# Altium project ESD_Mainboard.PrjPcb (part 1 of 2)
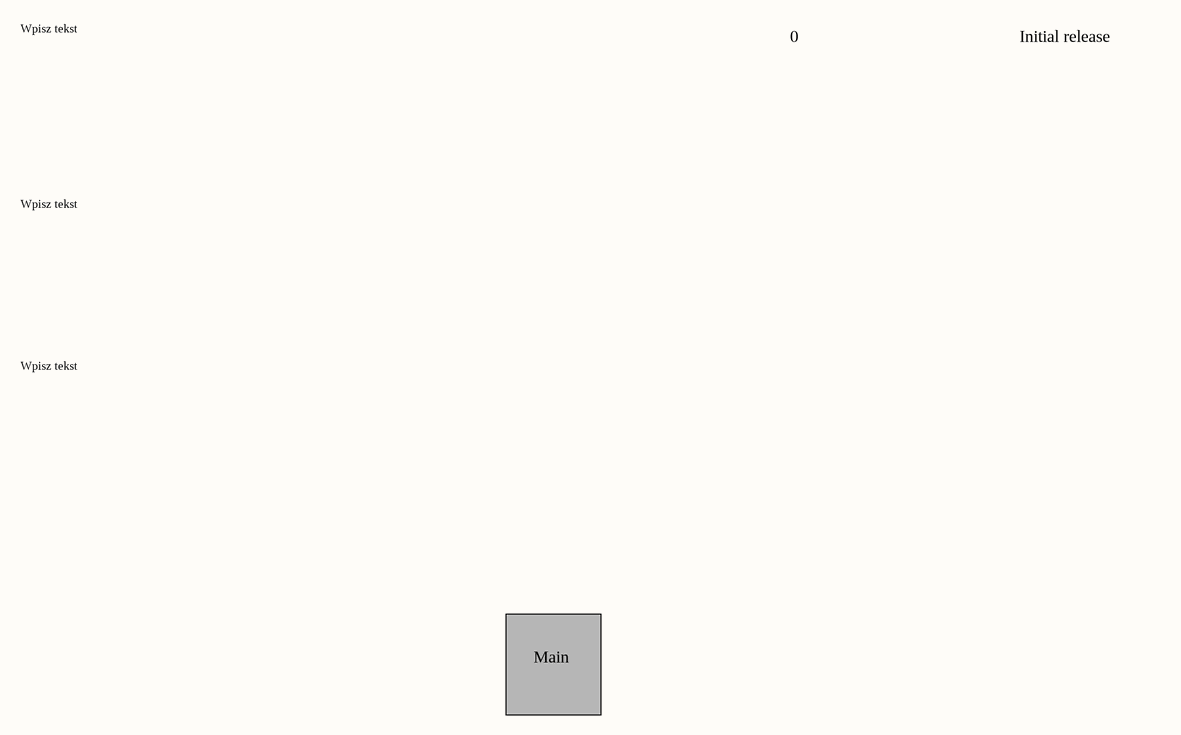
[diagram p0: ESD_Mainboard_Overview.SchDoc]
Title: Wpisz tekst; SpecificRequirements: Wpisz tekst; ShortDescriptionOfFunctionalities: Wpisz tekst; Revision: Wpisz tekst; ProjectID: Wpisz tekst; PCB_Number: Wpisz tekst; Overview: Wpisz tekst; ModuleID: Wpisz tekst; Engineer: Wpisz tekst; Date: Wpisz tekst; ApprovedBy: Wpisz tekst
9 sheets, 269 parts. Net scope: flat (ports and power ports of the same name join across sheets).
Board file: ESD_Mainboard_PCB.PcbDoc
Sheets:
  ESD_Mainboard_Overview.SchDoc
    U_Main = Main.SchDoc
      U_RFID = RFID.SchDoc
      U_ETHERNET = ETHERNET.SchDoc
      U_POWER_SUPPLY = POWER_SUPPLY.SchDoc
      U_IOs = IOs.SchDoc
      U_ANALOG_MEASUREMENT_CIRCUIT = ANALOG_MEASUREMENT_CIRCUIT.SchDoc
        U_ANALOG_BUFFER = ANALOG_BUFFER.SchDoc
        U_ANALOG_BUFFER = ANALOG_BUFFER.SchDoc
      U_MCU = MCU.SchDoc

## Sheet ESD_Mainboard_Overview.SchDoc: Wpisz tekst
size A4; SheetNumber: 1; SheetTotal: 2

### Sub-sheets
U_Main = Main.SchDoc: no entries

### Notes on the sheet
- 0
- Initial release
- Main
- Project description
- Revision table
- Overview
- REV
- Release date
- Description
- Specific requirements
- Short description of functionalities
- Variant description
- Schematic
- Design Engineer
- No.
- Info
- This document and the information it
- contains, including the principles of
- design are the proprietary confidential
- property of MC Electronics.
- Maciej Czerwiński Electronics
- NIP: PL1251711124
- Konopnickiej 16A
- 05-250 Radzymin
- biuro@mcelectronics.biz
- Approval Engineer
- This information is submitted to you
- with the agreement that it is not to be
- disclosed to third parties without prior
- written consent from MC Electronics.
- Acceptance of this document constitutes
- Title:
- greement to these restrictions.
- Date:
- Project ID
- Sheet:
- of
- Module ID -
- Revision
- -
- Size A4

## Sheet Main.SchDoc: Wpisz tekst
size A3; SheetNumber: 2; SheetTotal: 9
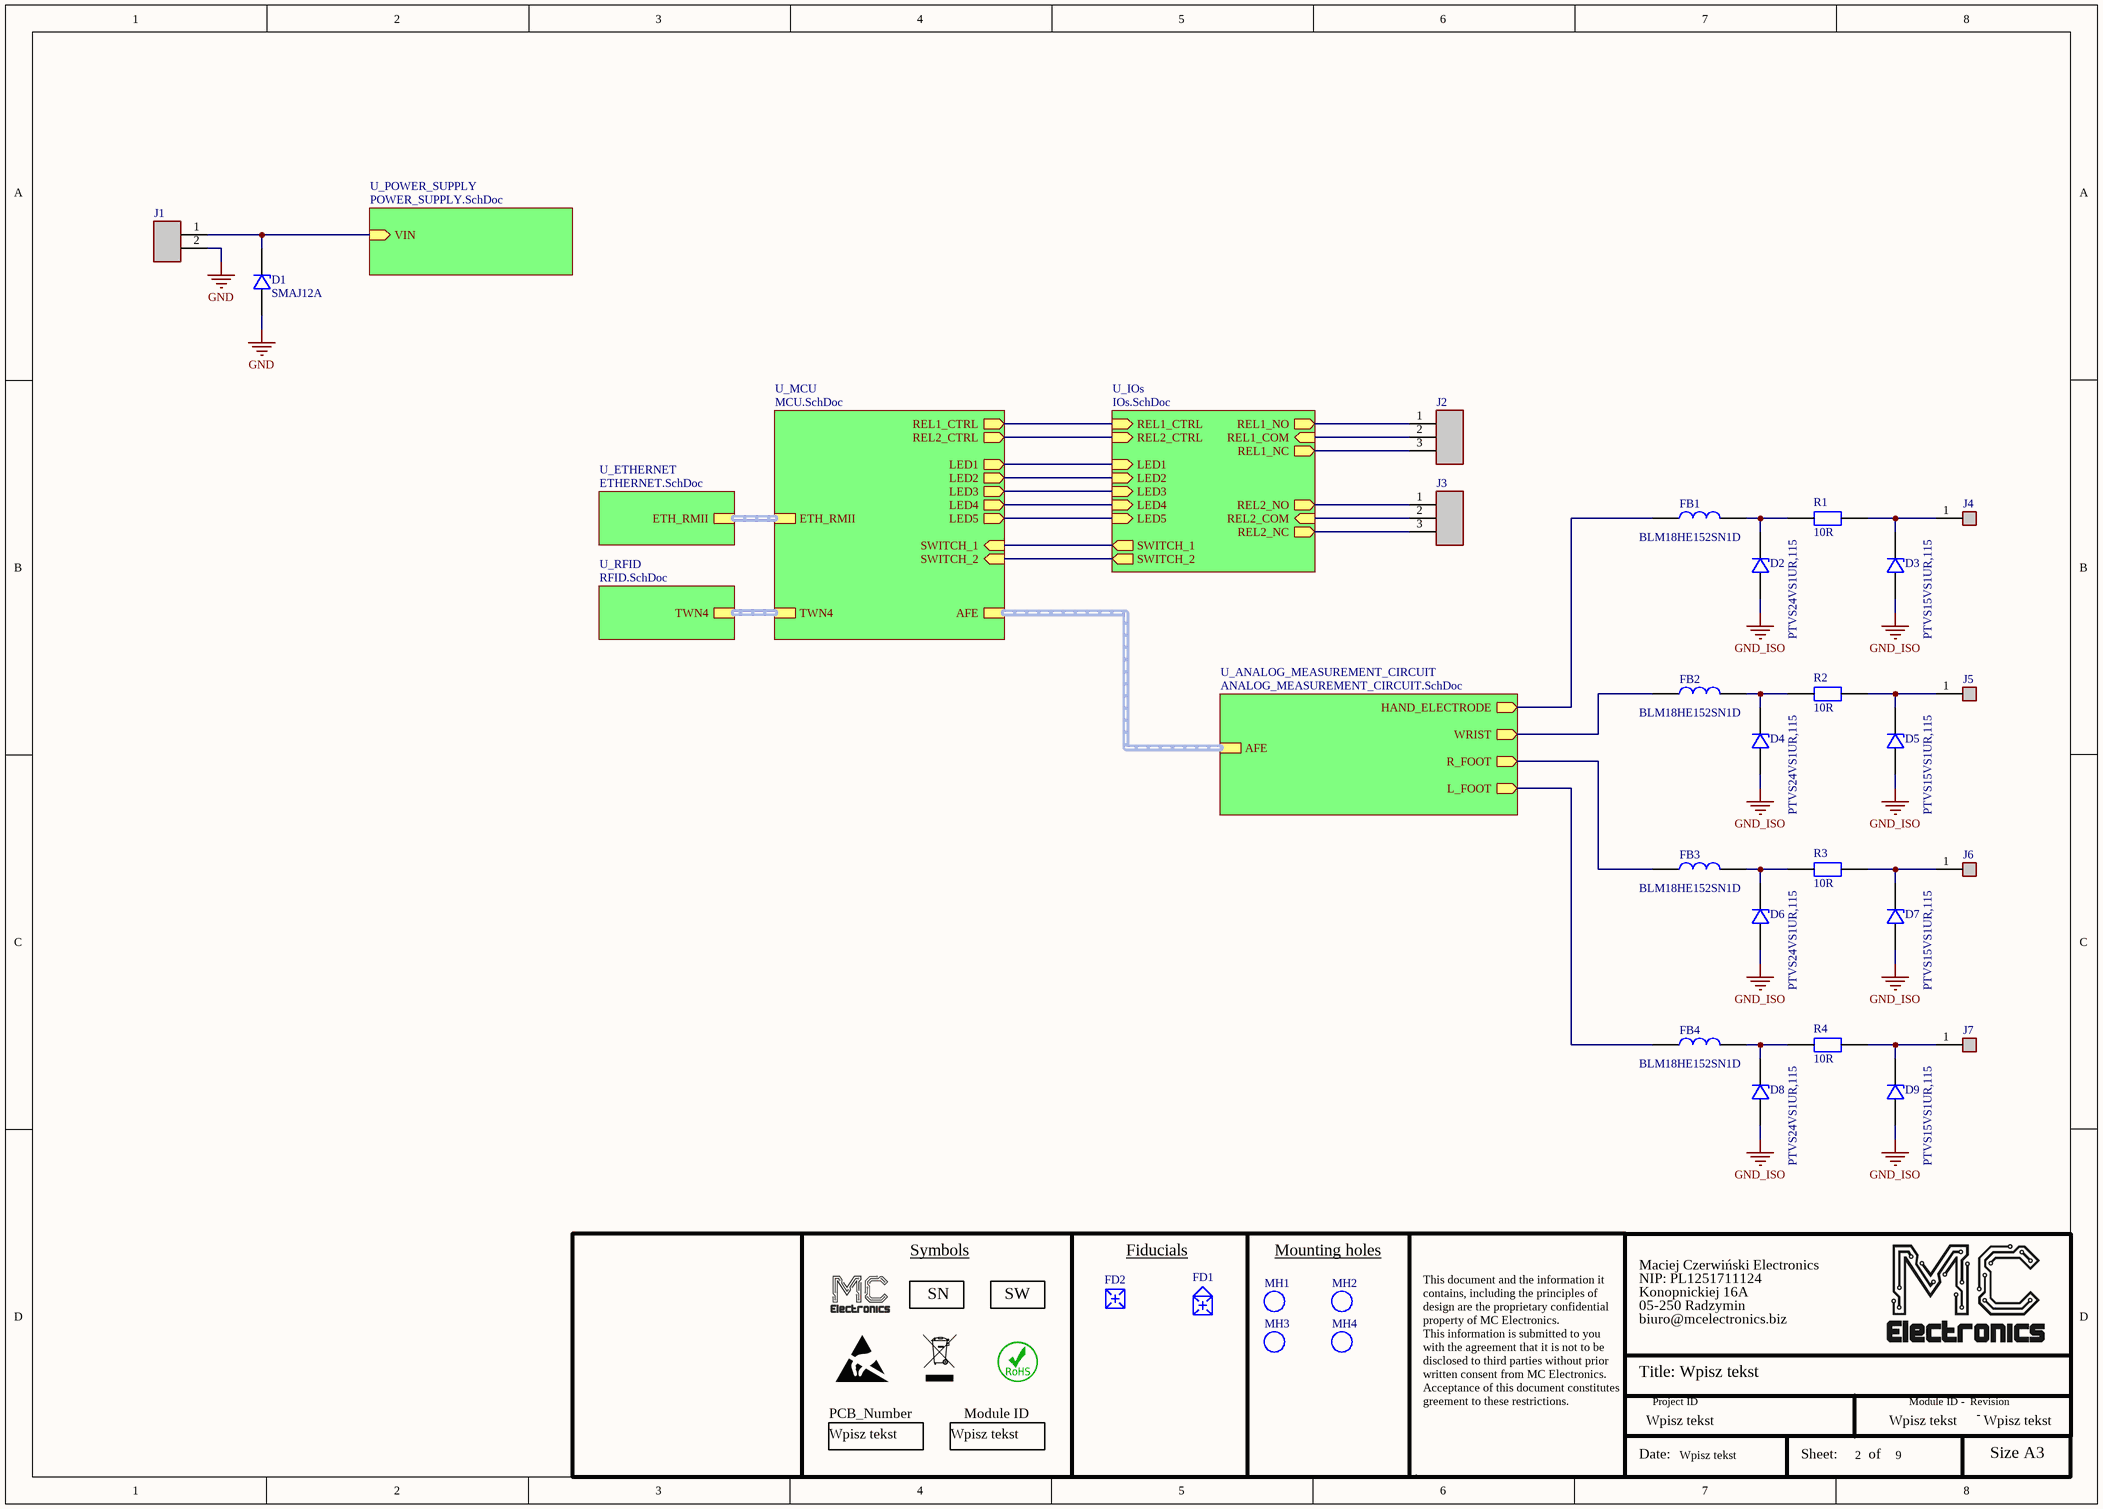
[diagram p1: Main.SchDoc]

### Parts
.PCB  PCB_Number: Wpisz tekst  [PCB number 60mils]  (hidden comment: PCB Number)
D1  SMAJ12A  [CAPM3216X18N]
D2  PTVS24VS1UR,115  [SOD123W]
D3  PTVS15VS1UR,115  [SOD123W]
D4  PTVS24VS1UR,115  [SOD123W]
D5  PTVS15VS1UR,115  [SOD123W]
D6  PTVS24VS1UR,115  [SOD123W]
D7  PTVS15VS1UR,115  [SOD123W]
D8  PTVS24VS1UR,115  [SOD123W]
D9  PTVS15VS1UR,115  [SOD123W]
FB1  BLM18HE152SN1D  [0603FB]
FB2  BLM18HE152SN1D  [0603FB]
FB3  BLM18HE152SN1D  [0603FB]
FB4  BLM18HE152SN1D  [0603FB]
FD1  Fiducial_house  [Fiducial_house_1mm]  (value not drawn)
FD2  Fiducial_square  [Fiducial_square_1mm]  (value not drawn)
J1  WE Terminal block 2x1 5.08mm  [WR-TBL Series 2365 1x2 5.08mm]  (value not drawn)
J2  WE Terminal block 3x1 5.08mm  [WR_TBL Series 2365 1x3 5,08mm]  (value not drawn)
J3  WE Terminal block 3x1 5.08mm  [WR_TBL Series 2365 1x3 5,08mm]  (value not drawn)
J4  Pin header male THT 1x1 2.54mm  [Pin header male THT 1x1 2,54mm]  (value not drawn)
J5  Pin header male THT 1x1 2.54mm  [Pin header male THT 1x1 2,54mm]  (value not drawn)
J6  Pin header male THT 1x1 2.54mm  [Pin header male THT 1x1 2,54mm]  (value not drawn)
J7  Pin header male THT 1x1 2.54mm  [Pin header male THT 1x1 2,54mm]  (value not drawn)
MH1  MHNP 3.2mm  [MHNP 3.2mm]  (value not drawn)  (no BOM)
MH2  MHNP 3.2mm  [MHNP 3.2mm]  (value not drawn)  (no BOM)
MH3  MHNP 3.2mm  [MHNP 3.2mm]  (value not drawn)  (no BOM)
MH4  MHNP 3.2mm  [MHNP 3.2mm]  (value not drawn)  (no BOM)
R1  value 10R  [2512R]  (hidden comment: 10R 1% 1.5W)
R2  value 10R  [2512R]  (hidden comment: 10R 1% 1.5W)
R3  value 10R  [2512R]  (hidden comment: 10R 1% 1.5W)
R4  value 10R  [2512R]  (hidden comment: 10R 1% 1.5W)
S1  Serial number place  [Serial number place 10x20mm]  (value not drawn)  (no BOM)
S2  SW rev. 8x16mm  [SW rev. 8x16mm]  (value not drawn)  (no BOM)
S3  MC Logo 10mm  [MC Logo 10mm]  (value not drawn)  (no BOM)
S4  ESD 10mm  [ESD 10mm]  (value not drawn)  (no BOM)
S5  WEEE 10mm  [WEEE 10mm]  (value not drawn)  (no BOM)
S6  RoHS 10mm  [RoHS 10mm]  (value not drawn)  (no BOM)
S7  Module ID: Wpisz tekst  [Module ID 60mils]  (hidden comment: Module ID 60mils)  (no BOM)

### Sub-sheets
U_ANALOG_MEASUREMENT_CIRCUIT = ANALOG_MEASUREMENT_CIRCUIT.SchDoc: HAND_ELECTRODE (out), WRIST (out), R_FOOT (out), L_FOOT (out), AFE (harness AFE)
U_ETHERNET = ETHERNET.SchDoc: ETH_RMII (harness ETH_RMII)
U_IOs = IOs.SchDoc: REL1_NO (out), REL2_NC (out), REL2_NO (out), REL1_NC (out), REL1_COM (in), REL2_COM (in), REL1_CTRL (in), REL2_CTRL (in), LED1 (in), LED2 (in), LED3 (in), LED4 (in), LED5 (in), SWITCH_1 (out), SWITCH_2 (out)
U_MCU = MCU.SchDoc: REL1_CTRL (out), REL2_CTRL (out), LED5 (out), LED4 (out), LED3 (out), LED2 (out), LED1 (out), ETH_RMII (harness ETH_RMII), TWN4 (harness TWN4), AFE (harness AFE), SWITCH_1 (in), SWITCH_2 (in)
U_POWER_SUPPLY = POWER_SUPPLY.SchDoc: VIN (in)
U_RFID = RFID.SchDoc: TWN4 (harness TWN4)

### Nets
GND: D1.2 J1.2
GND_ISO: D2.2 D3.2 D4.2 D5.2 D6.2 D7.2 D8.2 D9.2
NetD1_1: D1.1 J1.1 ; sheet U_POWER_SUPPLY/VIN
NetD2_1: D2.1 FB1.2 R1.2
NetD3_1: D3.1 J4.1 R1.1
NetD4_1: D4.1 FB2.2 R2.2
NetD5_1: D5.1 J5.1 R2.1
NetD6_1: D6.1 FB3.2 R3.2
NetD7_1: D7.1 J6.1 R3.1
NetD8_1: D8.1 FB4.2 R4.2
NetD9_1: D9.1 J7.1 R4.1
NetFB1_1: FB1.1 ; sheet U_ANALOG_MEASUREMENT_CIRCUIT/HAND_ELECTRODE
NetFB2_1: FB2.1 ; sheet U_ANALOG_MEASUREMENT_CIRCUIT/WRIST
NetFB3_1: FB3.1 ; sheet U_ANALOG_MEASUREMENT_CIRCUIT/R_FOOT
NetFB4_1: FB4.1 ; sheet U_ANALOG_MEASUREMENT_CIRCUIT/L_FOOT
NetJ2_1: J2.1 ; sheet U_IOs/REL1_NO
NetJ2_2: J2.2 ; sheet U_IOs/REL1_COM
NetJ2_3: J2.3 ; sheet U_IOs/REL1_NC
NetJ3_1: J3.1 ; sheet U_IOs/REL2_NO
NetJ3_2: J3.2 ; sheet U_IOs/REL2_COM
NetJ3_3: J3.3 ; sheet U_IOs/REL2_NC
(unnamed): sheet U_IOs/REL1_CTRL, sheet U_MCU/REL1_CTRL
(unnamed): sheet U_IOs/REL2_CTRL, sheet U_MCU/REL2_CTRL
(unnamed): sheet U_IOs/LED1, sheet U_MCU/LED1
(unnamed): sheet U_IOs/LED2, sheet U_MCU/LED2
(unnamed): sheet U_IOs/LED3, sheet U_MCU/LED3
(unnamed): sheet U_IOs/LED4, sheet U_MCU/LED4
(unnamed): sheet U_IOs/LED5, sheet U_MCU/LED5
(unnamed): sheet U_IOs/SWITCH_1, sheet U_MCU/SWITCH_1
(unnamed): sheet U_IOs/SWITCH_2, sheet U_MCU/SWITCH_2

### Buses and harness runs
harness sheet U_ANALOG_MEASUREMENT_CIRCUIT/AFE = sheet U_MCU/AFE
harness sheet U_ETHERNET/ETH_RMII = sheet U_MCU/ETH_RMII
harness sheet U_MCU/TWN4 = sheet U_RFID/TWN4

### Notes on the sheet
- Symbols
- Fiducials
- Mounting holes
- This document and the information it
- contains, including the principles of
- design are the proprietary confidential
- property of MC Electronics.
- Maciej Czerwiński Electronics
- NIP: PL1251711124
- Konopnickiej 16A
- 05-250 Radzymin
- biuro@mcelectronics.biz
- This information is submitted to you
- with the agreement that it is not to be
- disclosed to third parties without prior
- written consent from MC Electronics.
- Acceptance of this document constitutes
- Title:
- greement to these restrictions.
- Date:
- Project ID
- Sheet:
- of
- Module ID -
- Revision
- -
- Size A3
- (in symbol MC-CMP-012-00013-3) SN
- (in symbol MC-CMP-012-00014-5) SW
- (in symbol MC-CMP-012-00021-4) PCB_Number

### Library data of the parts
.PCB = MC-CMP-012-00021-4: Generic: No; MC_ID: Wpisz tekst; Mount type: SMT
D1 = SMAJ12A: TVS unidirectional 14V; Generic: No; MC_ID: TVS00040; Specific PN: SMAJ12A; Mount type: SMT
D2 D4 D6 D8 = PTVS24VS1UR,115: Diode: TVS; 400W; 28.1V; 10.3A; unidirectional; SOD123W; max.150°C; Generic: No; MC_ID: xx; Specific PN: PTVS24VS1UR,115; Mount type: SMT
D3 D5 D7 D9 = PTVS15VS1UR,115: Diode: TVS; 400W; 17.6V; 16.4A; unidirectional; SOD123W; max.150°C, 1nA; Generic: No; MC_ID: xx; Specific PN: PTVS15VS1UR,115; Mount type: SMT
FB1-FB4 = BLM18HE152SN1D: Ferryt: koralik; Imp.@ 100MHz: 1500Ω; SMD; 0,5A; 0603; R: 0,5Ω; BLM; Generic: No; MC_ID: FB00077; Specific PN: BLM18HE152SN1D; Mount type: SMT
FD1 = Fiducial_house: 1mm house fiducial; Generic: Yes; MC_ID: FID_H; Mount type: SMT
FD2 = Fiducial_square: 1mm square fiducial; Generic: Yes; MC_ID: FID_S; Mount type: SMT
J1 = WE_691236510002: Generic: Yes; MC_ID: CON00639; Mount type: THT; Specific PN: WE_691236510002
J2 J3 = WE_691236510003: Generic: Yes; MC_ID: CON00638; Mount type: THT; Specific PN: WE_691236510003
J4-J7 = GP_1x1: Pin header male THT 1x1 2.54mm vertical; Generic: Yes; MC_ID: -; Specific PN: GP_1x1; Mount type: THT
MH1-MH4 = MHNP 3.2mm: Mounting hole none plated, 3.2mm diameter; Generic: Yes; MC_ID: xx; Mount type: THT
R1-R4 = SPEC_10R_1%_1.5W_2512: Lead (Pb)-Bearing Pulse Proof, High Power Thick Film Chip Resistors 10R 2512; Specific PN: CRCW251210R0FKTGHP; Generic: No; MC_ID: R00765; Mount type: SMT
S1 = MC-CMP-012-00013-3: 10x20mm place for SN stick; Generic: No; Mount type: SMT; MC_ID: -
S2 = MC-CMP-012-00014-5: SW rev. place 8x16mm; Generic: No; Mount type: SMT; MC_ID: -
S3 = MC-CMP-012-00001-7: Generic: No; Mount type: SMT; MC_ID: -
S4 = MC-CMP-012-00005-7: ESD symbol 10mm; Generic: No; MC_ID: -; Mount type: SMT
S5 = MC-CMP-012-00009-5: WEEE bin symbol 10mm; Generic: No; MC_ID: -; Mount type: SMT
S6 = MC-CMP-012-00017-7: RoHS sign 10mm; Generic: No; Mount type: SMT; MC_ID: -
S7 = MC-CMP-012-00015-4: Module ID 60mils text height; Generic: No; MC_ID: -; Mount type: SMT

## Sheet RFID.SchDoc: Wpisz tekst
size A4; SheetNumber: 8; SheetTotal: 9
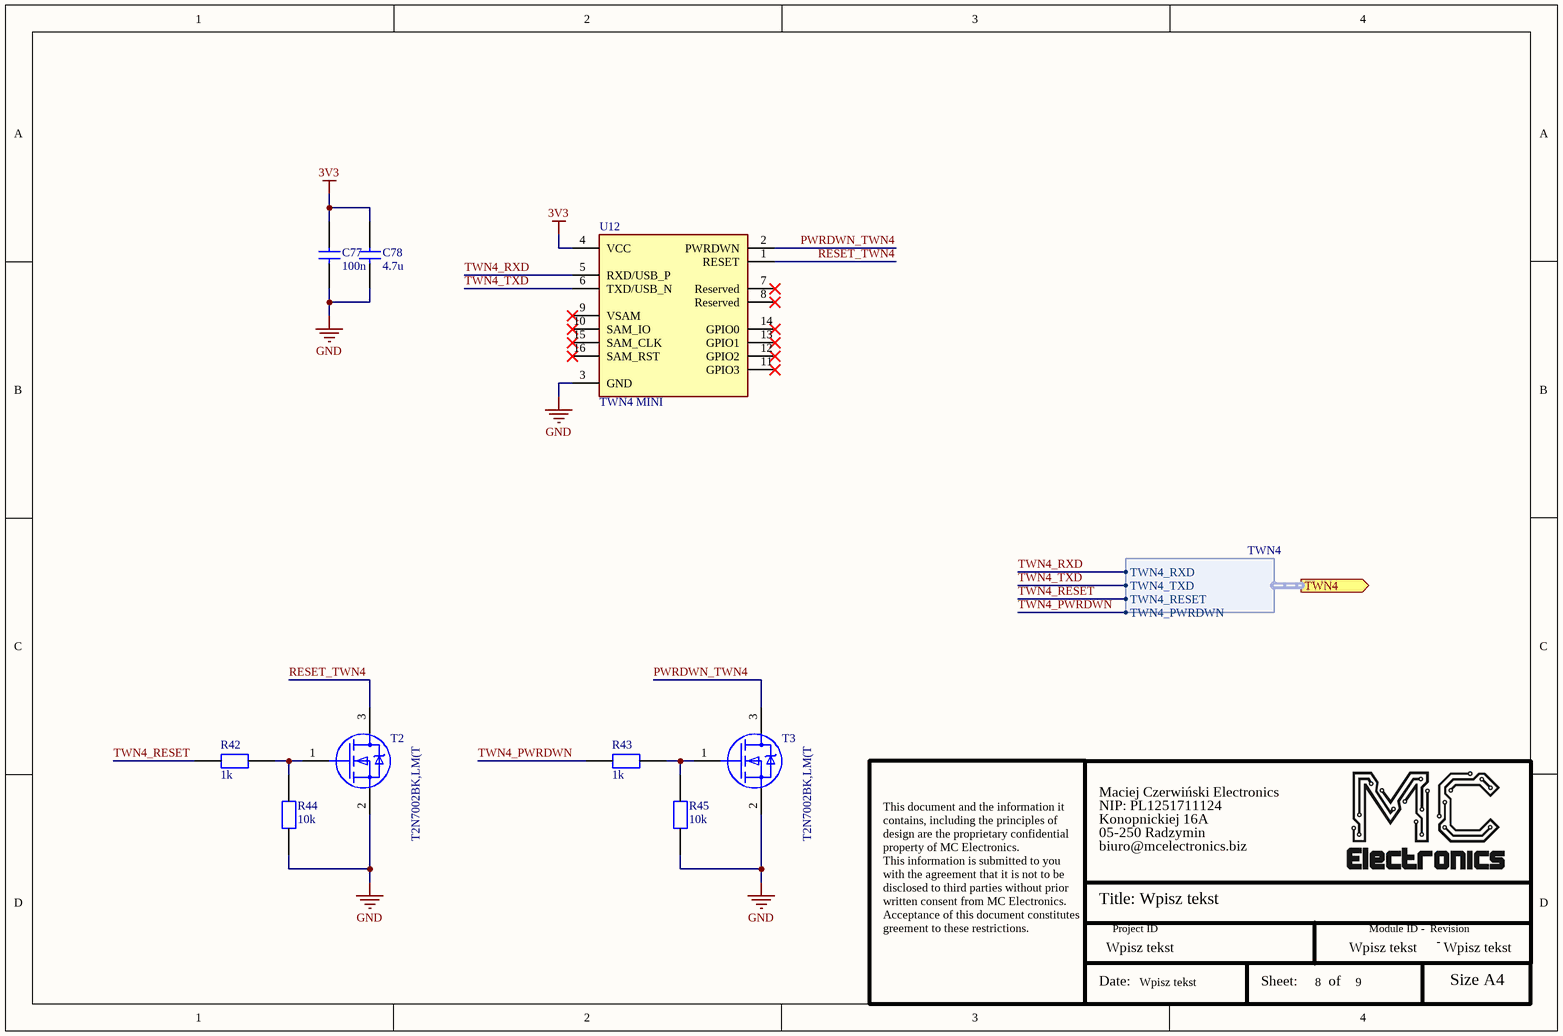
[diagram p2: RFID.SchDoc]

### Parts
C77  value 100n  [0603C]  (hidden comment: 100nF 50V X7R 10%)
C78  value 4.7u  [0603C]  (hidden comment: 4.7uF 16V X5R 10%)
R42  value 1k  [0603R]  (hidden comment: 1k 1% 0.1W)
R43  value 1k  [0603R]  (hidden comment: 1k 1% 0.1W)
R44  value 10k  [0603R]  (hidden comment: 10k 1% 0.1W)
R45  value 10k  [0603R]  (hidden comment: 10k 1% 0.1W)
T2  T2N7002BK,LM(T  [SOT95P235X110-3N]
T3  T2N7002BK,LM(T  [SOT95P235X110-3N]
U12  TWN4 MINI  [TWN4 MULTITECH HF MINI READER]

### Ports
TWN4 (out, harness TWN4)

### Harnesses
TWN4: TWN4_RXD, TWN4_TXD, TWN4_RESET, TWN4_PWRDWN

### Nets
3V3: C77.2 C78.2 U12.4(VCC)
GND: C77.1 C78.1 R44.2 R45.2 T2.2(E) T3.2(E) U12.3(GND)
PWRDWN_TWN4: T3.3(C) U12.2(PWRDWN)
RESET_TWN4: T2.3(C) U12.1(RESET)
TWN4_PWRDWN: R43.2 ; port TWN4.TWN4_PWRDWN
TWN4_RESET: R42.2 ; port TWN4.TWN4_RESET
TWN4_RXD: U12.5(RXD/USB_P) ; port TWN4.TWN4_RXD
TWN4_TXD: U12.6(TXD/USB_N) ; port TWN4.TWN4_TXD
NetR42_1: R42.1 R44.1 T2.1(B)
NetR43_1: R43.1 R45.1 T3.1(B)

Not connected (* = marked no-connect by the designer): U12 7(Reserved)* 8(Reserved)* 9(VSAM)* 10(SAM_IO)* 11(GPIO3)* 12(GPIO2)* 13(GPIO1)* 14(GPIO0)* 15(SAM_CLK)* 16(SAM_RST)*

### Notes on the sheet
- This document and the information it
- contains, including the principles of
- design are the proprietary confidential
- property of MC Electronics.
- Maciej Czerwiński Electronics
- NIP: PL1251711124
- Konopnickiej 16A
- 05-250 Radzymin
- biuro@mcelectronics.biz
- This information is submitted to you
- with the agreement that it is not to be
- disclosed to third parties without prior
- written consent from MC Electronics.
- Acceptance of this document constitutes
- Title:
- greement to these restrictions.
- Date:
- Project ID
- Sheet:
- of
- Module ID -
- Revision
- -
- Size A4

### Library data of the parts
C77 = GEN_100nF_50V_X7R_10%_0603: Generic capacitor 100n 0603; MC_ID: C00001; Generic: Yes; Mount type: SMT
C78 = GEN_4.7uF_16V_X5R_10%_0603: Generic capacitor 4.7u 0603; MC_ID: C00066; Generic: Yes; Mount type: SMT
R42 R43 = GEN_1k_1%_0.1W_0603: Generic resistor 1k 0603; Generic: Yes; MC_ID: R00027; Mount type: SMT
R44 R45 = GEN_10k_1%_0.1W_0603: Generic resistor 10k 0603; MC_ID: R00003; Generic: Yes; Mount type: SMT
T2 T3 = T2N7002BK,LM(T: T2N7002BK,LM(T N-MOSFET 60V 0,4A GSD SOT23; Generic: No; MC_ID: TPO00095; Mount type: SMT; Specific PN: T2N7002BK,LM(T
U12 = TWN4 MINI: TWN4 MULTITECH HF MINI READER; MC_ID: x; Generic: No; Specific PN: TWN4 MULTITECH HF MINI READER; Mount type: SMT

## Sheet ETHERNET.SchDoc: Wpisz tekst
size A3; SheetNumber: 7; SheetTotal: 9
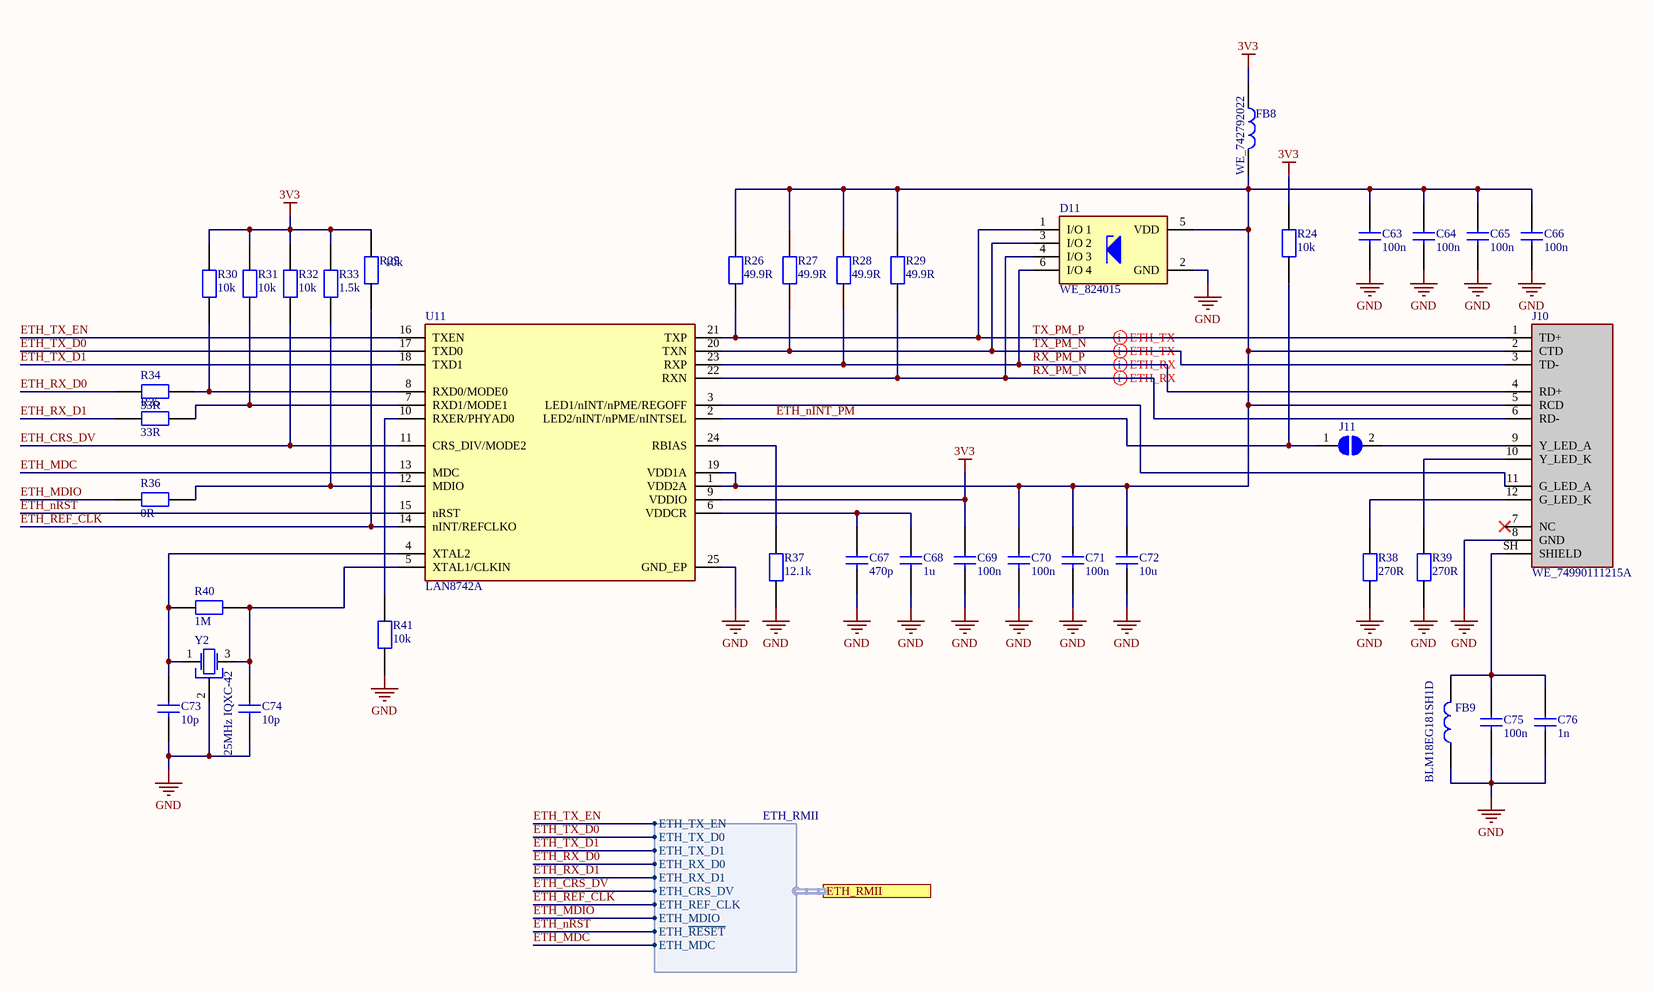
[diagram p3: ETHERNET.SchDoc]

### Parts
C63  value 100n  [0603C]  (hidden comment: 100nF 50V X7R 10%)
C64  value 100n  [0603C]  (hidden comment: 100nF 50V X7R 10%)
C65  value 100n  [0603C]  (hidden comment: 100nF 50V X7R 10%)
C66  value 100n  [0603C]  (hidden comment: 100nF 50V X7R 10%)
C67  value 470p  [0603C]  (hidden comment: 470pF 100V X7R 5%)
C68  value 1u  [0603C]  (hidden comment: 1uF 16V X5R 10%)
C69  value 100n  [0603C]  (hidden comment: 100nF 50V X7R 10%)
C70  value 100n  [0603C]  (hidden comment: 100nF 50V X7R 10%)
C71  value 100n  [0603C]  (hidden comment: 100nF 50V X7R 10%)
C72  value 10u  [0603C]  (hidden comment: 10uF 25V X5R 10%)
C73  value 10p  [0603C]  (hidden comment: 10pF 50V C0G 5%)
C74  value 10p  [0603C]  (hidden comment: 10pF 50V C0G 5%)
C75  value 100n  [0603C]  (hidden comment: 100nF 50V X7R 10%)
C76  value 1n  [0603C]  (hidden comment: 1nF 50V X7R 10%)
D11  WE_824015  [SOT95P280X110-6N]
FB8  WE_742792022  [0805FB]
FB9  BLM18EG181SH1D  [0603FB]
J10  WE_74990111215A  [Wurth 74990111215A]
J11  2 pole open jumper  [2_pole_open_jumper]  (value not drawn)  (no BOM)
R24  value 10k  [0603R]  (hidden comment: 10k 1% 0.1W)
R25  value 10k  [0603R]  (hidden comment: 10k 1% 0.1W)
R26  value 49.9R  [0603R]  (hidden comment: 49.9R 1% 0.1W)
R27  value 49.9R  [0603R]  (hidden comment: 49.9R 1% 0.1W)
R28  value 49.9R  [0603R]  (hidden comment: 49.9R 1% 0.1W)
R29  value 49.9R  [0603R]  (hidden comment: 49.9R 1% 0.1W)
R30  value 10k  [0603R]  (hidden comment: 10k 1% 0.1W)
R31  value 10k  [0603R]  (hidden comment: 10k 1% 0.1W)
R32  value 10k  [0603R]  (hidden comment: 10k 1% 0.1W)
R33  value 1.5k  [0603R]  (hidden comment: 1.5k 1% 0.1W)
R34  value 33R  [0603R]  (hidden comment: 33R 1% 0.1W)
R35  value 33R  [0603R]  (hidden comment: 33R 1% 0.1W)
R36  value 0R  [0603R]  (hidden comment: 0R 1% 0.1W)
R37  value 12.1k  [0603R]  (hidden comment: 12.1k 1% 0.125W)
R38  value 270R  [0603R]  (hidden comment: 270R 1% 0.125W)
R39  value 270R  [0603R]  (hidden comment: 270R 1% 0.125W)
R40  value 1M  [0603R]  (hidden comment: 1M 1% 0.1W)
R41  value 10k  [0603R]  (hidden comment: 10k 1% 0.1W)
U11  LAN8742A  [FP-24-S4QFN-4x4B-0_5P-IPC_B]
Y2  25MHz IQXC-42  [Quartz crystal 4pin 2x1.6mm]

### Ports
ETH_RMII (harness ETH_RMII)

### Harnesses
ETH_RMII: ETH_MDIO, ETH_~{RESET}, ETH_CRS_DV, ETH_RX_D1, ETH_RX_D0, ETH_TX_D1, ETH_TX_D0, ETH_TX_EN, ETH_REF_CLK, ETH_MDC

### Nets
3V3: C69.2 FB8.1 R24.1 R25.1 R30.1 R31.1 R32.1 R33.1 U11.9(VDDIO)
GND: C63.1 C64.1 C65.1 C66.1 C67.1 C68.1 C69.1 C70.1 C71.1 C72.1 C73.1 C74.1 C75.1 C76.1 D11.2(GND) FB9.1 J10.8(GND) R37.2 R38.2 R39.2 R41.2 U11.25(GND_EP) Y2.2(GND)
ETH_CRS_DV: R32.2 U11.11(CRS_DIV/MODE2) ; port ETH_RMII.ETH_CRS_DV
ETH_MDC: U11.13(MDC) ; port ETH_RMII.ETH_MDC
ETH_MDIO: R36.2 ; port ETH_RMII.ETH_MDIO
ETH_nINT_PM: J11.1 R24.2 U11.2(LED2/nINT/nPME/nINTSEL)
ETH_nRST: U11.15(nRST) ; port ETH_RMII.ETH_~{RESET}
ETH_REF_CLK: R25.2 U11.14(nINT/REFCLKO) ; port ETH_RMII.ETH_REF_CLK
ETH_RX_D0: R34.2 ; port ETH_RMII.ETH_RX_D0
ETH_RX_D1: R35.2 ; port ETH_RMII.ETH_RX_D1
ETH_TX_D0: U11.17(TXD0) ; port ETH_RMII.ETH_TX_D0
ETH_TX_D1: U11.18(TXD1) ; port ETH_RMII.ETH_TX_D1
ETH_TX_EN: U11.16(TXEN) ; port ETH_RMII.ETH_TX_EN
RX_PM_N: D11.4(I/O_3) J10.6(RD-) R29.2 U11.22(RXN)
RX_PM_P: D11.6(I/O_4) J10.4(RD+) R28.2 U11.23(RXP)
TX_PM_N: D11.3(I/O_2) J10.3(TD-) R27.2 U11.20(TXN)
TX_PM_P: D11.1(I/O_1) J10.1(TD+) R26.2 U11.21(TXP)
NetC63_2: C63.2 C64.2 C65.2 C66.2 C70.2 C71.2 C72.2 D11.5(VDD) FB8.2 J10.2(CTD) J10.5(RCD) R26.1 R27.1 R28.1 R29.1 U11.1(VDD2A) U11.19(VDD1A)
NetC67_2: C67.2 C68.2 U11.6(VDDCR)
NetC73_2: C73.2 R40.2 U11.4(XTAL2) Y2.1(Crystal)
NetC74_2: C74.2 R40.1 U11.5(XTAL1/CLKIN) Y2.3(Crystal)
NetC75_2: C75.2 C76.2 FB9.2 J10.SH(SHIELD)
NetJ10_9: J10.9(Y_LED_A) J11.2
NetJ10_10: J10.10(Y_LED_K) R39.1
NetJ10_11: J10.11(G_LED_A) U11.3(LED1/nINT/nPME/REGOFF)
NetJ10_12: J10.12(G_LED_K) R38.1
NetR30_2: R30.2 R34.1 U11.8(RXD0/MODE0)
NetR31_2: R31.2 R35.1 U11.7(RXD1/MODE1)
NetR33_2: R33.2 R36.1 U11.12(MDIO)
NetR37_1: R37.1 U11.24(RBIAS)
NetR41_1: R41.1 U11.10(RXER/PHYAD0)

Not connected (* = marked no-connect by the designer): J10 7(NC)*

### Layout directives
differential pair; differential pair class DIFF_ETH: RX_PM_N, RX_PM_P, TX_PM_N, TX_PM_P

### Notes on the sheet
- This document and the information it
- contains, including the principles of
- design are the proprietary confidential
- property of MC Electronics.
- Maciej Czerwiński Electronics
- NIP: PL1251711124
- Konopnickiej 16A
- 05-250 Radzymin
- biuro@mcelectronics.biz
- This information is submitted to you
- with the agreement that it is not to be
- disclosed to third parties without prior
- written consent from MC Electronics.
- Acceptance of this document constitutes
- Title:
- greement to these restrictions.
- Date:
- Project ID
- Sheet:
- of
- Module ID -
- Revision
- -
- Size A3

### Library data of the parts
C63-C66 C69-C71 C75 = GEN_100nF_50V_X7R_10%_0603: as C77 on sheet RFID; Mount type: SMT
C67 = GEN_470pF_100V_X7R_5%_0603: Generic capacitor 470p 0603; MC_ID: C00025; Generic: Yes; Mount type: SMT
C68 = GEN_1uF_16V_X5R_10%_0603: Generic capacitor 1u 0603; Generic: Yes; MC_ID: C00017; Mount type: SMT
C72 = GEN_10uF_25V_X5R_10%_0603: Generic capacitor 10u 0603; Generic: Yes; MC_ID: C00094; Mount type: SMT
C73 C74 = GEN_10pF_50V_C0G_5%_0603: Generic capacitor 10p 0603; MC_ID: C00002; Generic: Yes; Mount type: SMT
C76 = GEN_1nF_50V_X7R_10%_0603: Generic capacitor 1nF 50V 0603; MC_ID: C00024; Generic: Yes; Mount type: SMT
D11 = WE_824015: TVS for ethernet and USB 2.0; MC_ID: TVS00028; Generic: No; Mount type: SMT; Specific PN: WE_824015
FB8 = WE_742792022: Ferrite bead 0603 1A 50mOhm, 1MHz - 180Ohm; MC_ID: FB00017; Generic: No; Mount type: SMT; Specific PN: WE_742792022
FB9 = BLM18EG181SH1D: Ferrite bead 0603 1A 50mOhm, 1MHz - 180Ohm; Generic: No; MC_ID: FB00019; Specific PN: BLM18EG181SH1D; Mount type: SMT
J10 = WE_74990111215A: Ethernet connector with integrated isolation transformer and 2 LEDs; Generic: No; MC_ID: CON00210; Specific PN: WE_74990111215A; Mount type: THT
J11 = MC-CMP-016-00012-5: Generic: No; MC_ID: xx; Mount type: SMT
R24 R25 R30-R32 R41 = GEN_10k_1%_0.1W_0603: as R44 on sheet RFID; Mount type: SMT
R26-R29 = GEN_49.9R_1%_0.1W_0603: Generic resistor 49.9R 0603; Generic: Yes; MC_ID: R00055; Mount type: SMT
R33 = GEN_1.5k_1%_0.1W_0603: Generic resistor 1.5k 0603; MC_ID: R00040; Generic: Yes; Mount type: SMT
R34 R35 = GEN_33R_1%_0.1W_0603: Generic resistor 33R 0603; MC_ID: R00050; Generic: Yes; Mount type: SMT
R36 = GEN_0R_1%_0.1W_0603: Generic resistor 0R 0603; Generic: Yes; MC_ID: R00300; Mount type: SMT
R37 = SPEC_12.1k_1%_0.125W_0603: Rezystor 12.1k 1% 0.125W; Generic: Yes; Specific PN: CRCW060312K1FKTABC; MC_ID: R00345; Mount type: SMT
R38 R39 = SPEC_270R_1%_0.125W_0603: Rezystor 270R 1% 0.125W; Generic: Yes; Specific PN: RC0603FR-07270RL; MC_ID: R00042; Mount type: SMT
R40 = GEN_1M_1%_0.1W_0603: Generic resistor 1M 0603; MC_ID: R00014; Generic: Yes; Mount type: SMT
U11 = LAN8742A: Small Footprint RMII 10/100 Ethernet Transceiver with HP / Auto-MDIX and flexPWR® Technology, QFN24; Generic: No; MC_ID: IC00767; Specific PN: LAN8742A-CZ; Mount type: SMT
Y2 = 25MHz IQXC-42: Quarz oscilator 25MHz 2x1.6x0.5mm; Generic: No; Specific PN: WE_830108212509; MC_ID: XTA00012; Mount type: SMT

## Sheet POWER_SUPPLY.SchDoc: Wpisz tekst
size A4; SheetNumber: 5; SheetTotal: 9
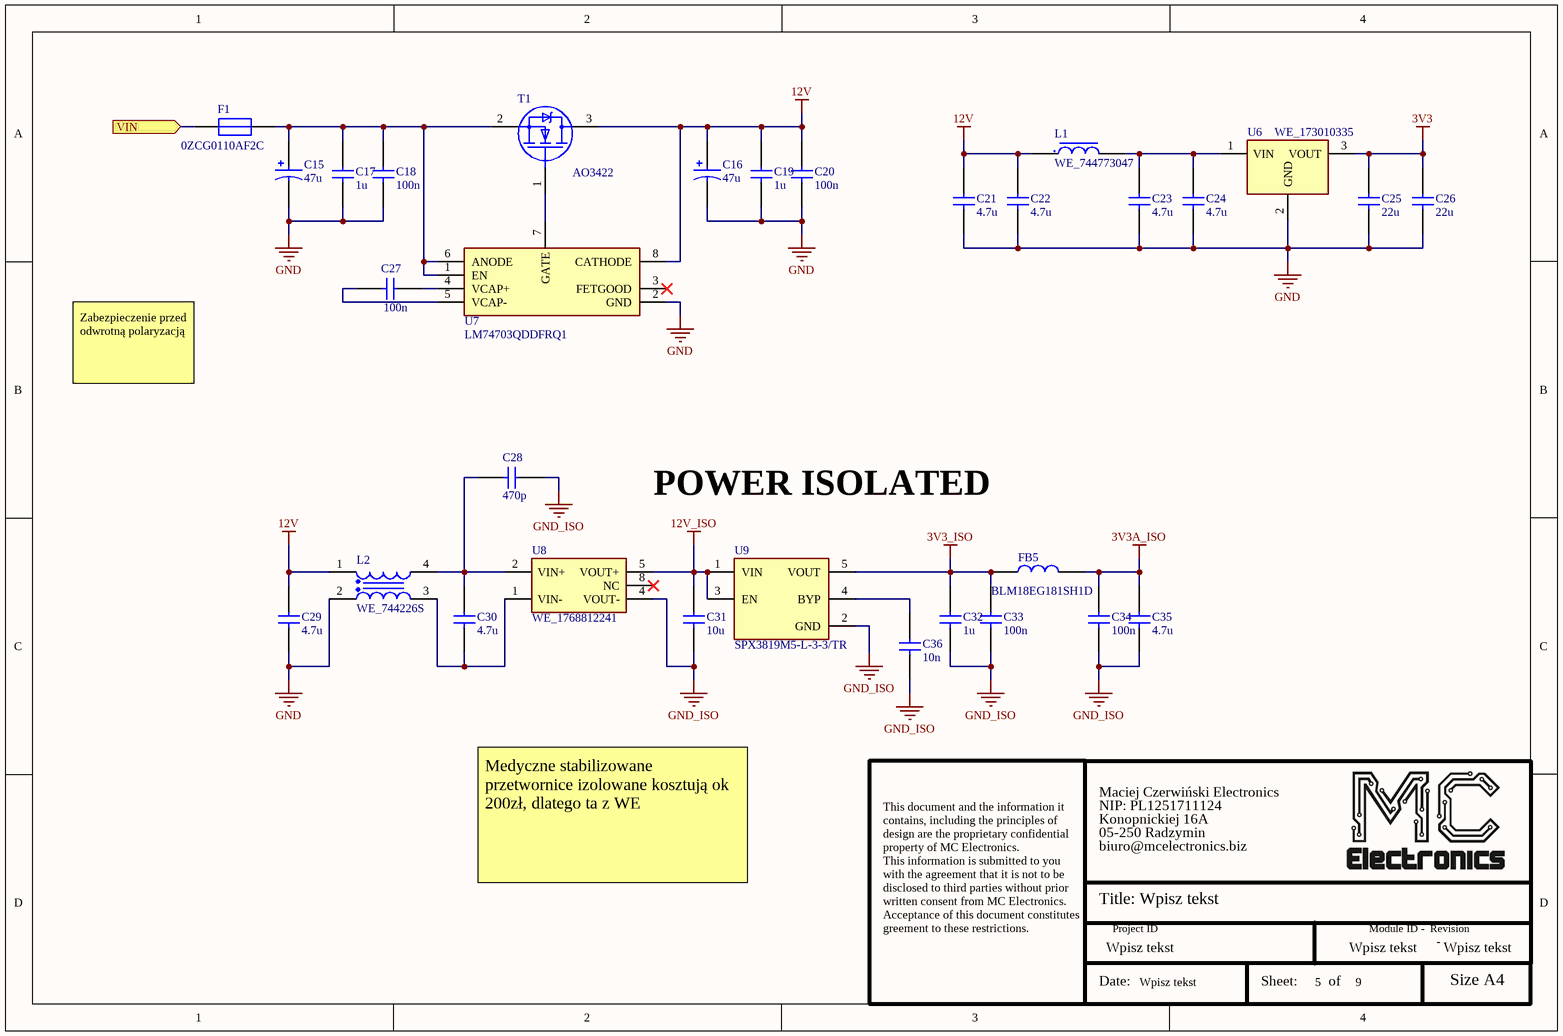
[diagram p4: POWER_SUPPLY.SchDoc]

### Parts
C15  value 47u  [CAPAE7866X65N]  (hidden comment: 47u 50V fi6.3x5.5mm)
C16  value 47u  [CAPAE7866X65N]  (hidden comment: 47u 50V fi6.3x5.5mm)
C17  value 1u  [0603C]  (hidden comment: 1uF 50V X5R 10%)
C18  value 100n  [0603C]  (hidden comment: 100nF 50V X7R 10%)
C19  value 1u  [0603C]  (hidden comment: 1uF 50V X5R 10%)
C20  value 100n  [0603C]  (hidden comment: 100nF 50V X7R 10%)
C21  value 4.7u  [1210C]  (hidden comment: 4.7uF 50V X5R 10%)
C22  value 4.7u  [1210C]  (hidden comment: 4.7uF 50V X5R 10%)
C23  value 4.7u  [1210C]  (hidden comment: 4.7uF 50V X5R 10%)
C24  value 4.7u  [1210C]  (hidden comment: 4.7uF 50V X5R 10%)
C25  value 22u  [1210C]  (hidden comment: 22uF 25V X5R 10%)
C26  value 22u  [1210C]  (hidden comment: 22uF 25V X5R 10%)
C27  value 100n  [0603C]  (hidden comment: 100nF 50V X7R 10%)
C28  value 470p  [1808C]  (hidden comment: 470pF 3kV X7R 10%)
C29  value 4.7u  [1210C]  (hidden comment: 4.7uF 16V X7R 10%)
C30  value 4.7u  [1210C]  (hidden comment: 4.7uF 16V X7R 10%)
C31  value 10u  [1210C]  (hidden comment: 10uF 16V X7R 10%)
C32  value 1u  [0603C]  (hidden comment: 1uF 16V X5R 10%)
C33  value 100n  [0603C]  (hidden comment: 100nF 50V X7R 10%)
C34  value 100n  [0603C]  (hidden comment: 100nF 50V X7R 10%)
C35  value 4.7u  [0603C]  (hidden comment: 4.7uF 16V X5R 10%)
C36  value 10n  [0603C]  (hidden comment: 10nF 50V X7R 10%)
F1  0ZCG0110AF2C  [Fuse_1812]
FB5  BLM18EG181SH1D  [0603FB]
L1  WE_744773047  [Inductor SMD 4.5x4mm]
L2  WE_744226S  [WE-SL2_L9.2W6H5]
T1  AO3422  [SOT95P235X110-3N]
U6  WE_173010335  [173010335]
U7  LM74703QDDFRQ1  [SOT23127P600-8N]
U8  WE_1768812241  [WE_1768812241]
U9  SPX3819M5-L-3-3/TR  [SOT95P280X110-5N]

### Ports
VIN (in)

### Nets
3V3: C25.2 C26.2 U6.3(VOUT)
3V3_ISO: C32.2 C33.2 FB5.1 U9.5(VOUT)
3V3A_ISO: C34.2 C35.2 FB5.2
12V: C16.1 C19.2 C20.2 C21.2 C22.2 C29.2 L1.1 L2.1 T1.3(C) U7.8(CATHODE)
12V_ISO: C31.2 U8.5(VOUT+) U9.1(VIN) U9.3(EN)
GND: C15.2 C16.2 C17.1 C18.1 C19.1 C20.1 C21.1 C22.1 C23.1 C24.1 C25.1 C26.1 C29.1 L2.2 U6.2(GND) U7.2(GND)
GND_ISO: C28.2 C31.1 C32.1 C33.1 C34.1 C35.1 C36.1 U8.4(VOUT-) U9.2(GND)
NetC15_1: C15.1 C17.2 C18.2 F1.1 T1.2(E) U7.1(EN) U7.6(ANODE)
NetC23_2: C23.2 C24.2 L1.2 U6.1(VIN)
NetC27_1: C27.1 U7.5(VCAP-)
NetC27_2: C27.2 U7.4(VCAP+)
NetC28_1: C28.1 C30.2 L2.4 U8.2(VIN+)
NetC30_1: C30.1 L2.3 U8.1(VIN-)
NetC36_2: C36.2 U9.4(BYP)
NetF1_2: F1.2 ; port VIN
NetT1_1: T1.1(B) U7.7(GATE)

Not connected (* = marked no-connect by the designer): U7 3(FETGOOD)*; U8 8(NC)*

### Notes on the sheet
- Zabezpieczenie przed odwrotną polaryzacją
- POWER ISOLATED
- Medyczne stabilizowane przetwornice izolowane kosztują ok 200zł, dlatego ta z WE
- This document and the information it
- contains, including the principles of
- design are the proprietary confidential
- property of MC Electronics.
- Maciej Czerwiński Electronics
- NIP: PL1251711124
- Konopnickiej 16A
- 05-250 Radzymin
- biuro@mcelectronics.biz
- This information is submitted to you
- with the agreement that it is not to be
- disclosed to third parties without prior
- written consent from MC Electronics.
- Acceptance of this document constitutes
- Title:
- greement to these restrictions.
- Date:
- Project ID
- Sheet:
- of
- Module ID -
- Revision
- -
- Size A4

### Library data of the parts
C15 C16 = GEN_47uF_50V_20%_SMD: Electrolitic capacitor 47u/50V 6.3x5.8mm; Generic: Yes; MC_ID: CPO00007; Mount type: SMT
C17 C19 = GEN_1uF_50V_X5R_10%_0603: Generic capacitor 1u 0603; MC_ID: C00037; Generic: Yes; Mount type: SMT
C18 C20 C27 C33 C34 = GEN_100nF_50V_X7R_10%_0603: as C77 on sheet RFID; Mount type: SMT
C21-C24 = GEN_4.7uF_50V_X5R_10%_1210: Generic capacitor 4.7uF 50V 1210; MC_ID: C00059; Generic: Yes; Mount type: SMT
C25 C26 = GEN_22uF_25V_X5R_10%_1210: Generic capacitor 22uF 25V 1210; Generic: Yes; MC_ID: C00013; Mount type: SMT
C28 = SPEC_470pF_3kV_X7R_10%_1808: Capacitor 470pF 3kV X7R 1808; MC_ID: x; Generic: Yes; Specific PN: WE_885342210003; Mount type: SMT
C29 C30 = SPEC_4.7uF_16V_X7R_10%_1210: Capacitor 4.7uF 16V X7R 1210; MC_ID: x; Generic: Yes; Specific PN: WE_885012209013; Mount type: SMT
C31 = SPEC_10uF_16V_X7R_10%_1210: Capacitor 10uF 16V X7R 1210; MC_ID: x; Generic: Yes; Specific PN: WE_885012209014; Mount type: SMT
C32 = GEN_1uF_16V_X5R_10%_0603: as C68 on sheet ETHERNET; Mount type: SMT
C35 = GEN_4.7uF_16V_X5R_10%_0603: as C78 on sheet RFID; Mount type: SMT
C36 = GEN_10nF_50V_X7R_10%_0603: Generic capacitor 10n 0603; Generic: Yes; MC_ID: C00038; Mount type: SMT
F1 = 0ZCG0110AF2C: 1.1A 16V  fuse, 1812; MC_ID: B00005; Generic: No; Specific PN: 0ZCG0110AF2C; Mount type: SMT
FB5 = BLM18EG181SH1D: as FB9 on sheet ETHERNET; Specific PN: BLM18EG181SH1D; Mount type: SMT
L1 = IND_4.7uH_1.85A_0.11R_4545: Inductor 4.7uH 1.82A; MC_ID: L00018; Generic: No; Specific PN: WE_744773047; Value: 4.7uH; Mount type: SMT
L2 = WE_744226S: Common mode choke 10uH 1.6A; Generic: No; MC_ID: x; Mount type: SMT; Specific PN: WE_744226S; Value: 10uH
T1 = AO3422: N-MOSFET;AO3422; 55V; 1,7A; 800mW; SOT23; Generic: No; MC_ID: TPO00046; Specific PN: AO3422; Mount type: SMT
U6 = WE_173010335: Fixed step down converter 3.3V/1A output; MC_ID: IC00022; Generic: No; Specific PN: WE_173010335; Mount type: THT
U7 = LM74703QDDFRQ1: Ideal diode controller; Generic: No; MC_ID: IC00776; Mount type: SMT; Specific PN: LM74703QDDFRQ1
U8 = WE_1768812241: Isolated converter 10.8-13.2/12V 1W; Generic: No; MC_ID: x; Specific PN: WE_1768812241; Mount type: SMT
U9 = SPX3819M5-L-3-3/TR: Linear regulator 3.3V 0.5A; Generic: No; MC_ID: IC00068; Mount type: SMT; Specific PN: SPX3819M5-L-3-3/TR

## Sheet IOs.SchDoc: Wpisz tekst
size A3; SheetNumber: 9; SheetTotal: 9
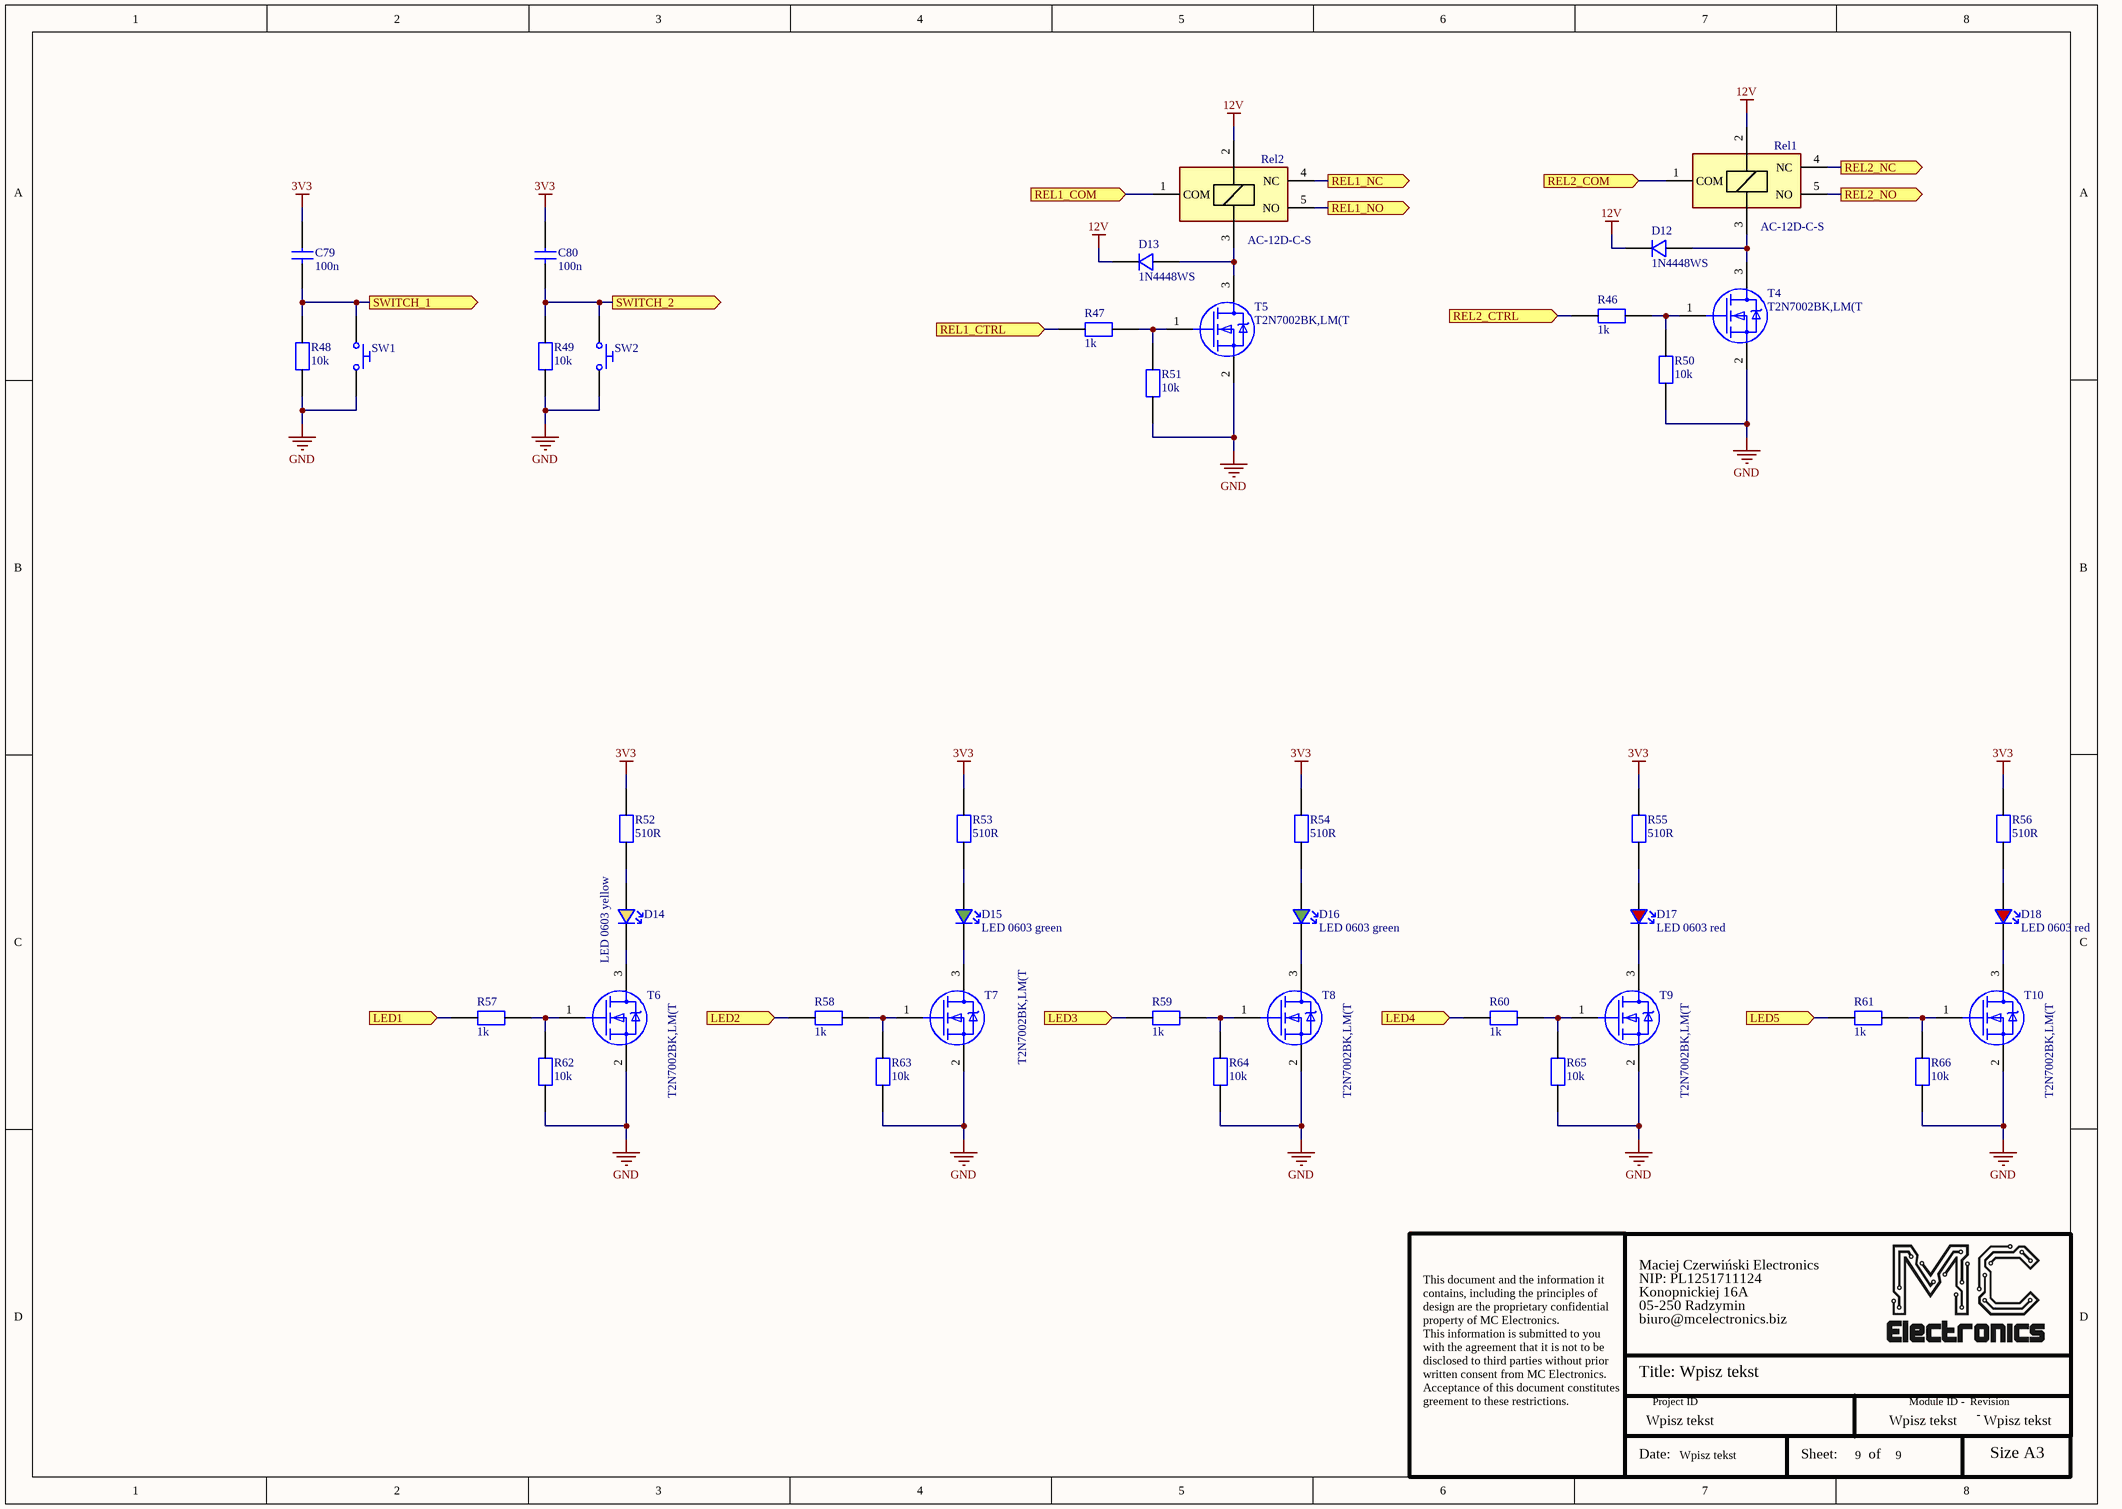
[diagram p5: IOs.SchDoc]

### Parts
C79  value 100n  [0603C]  (hidden comment: 100nF 50V X7R 10%)
C80  value 100n  [0603C]  (hidden comment: 100nF 50V X7R 10%)
D12  1N4448WS  [SODFL255125X120N]
D13  1N4448WS  [SODFL255125X120N]
D14  LED 0603 yellow  [0603LED_YELLOW]
D15  LED 0603 green  [0603LED_GREEN]
D16  LED 0603 green  [0603LED_GREEN]
D17  LED 0603 red  [0603LED_RED]
D18  LED 0603 red  [0603LED_RED]
R46  value 1k  [0603R]  (hidden comment: 1k 1% 0.1W)
R47  value 1k  [0603R]  (hidden comment: 1k 1% 0.1W)
R48  value 10k  [0603R]  (hidden comment: 10k 1% 0.1W)
R49  value 10k  [0603R]  (hidden comment: 10k 1% 0.1W)
R50  value 10k  [0603R]  (hidden comment: 10k 1% 0.1W)
R51  value 10k  [0603R]  (hidden comment: 10k 1% 0.1W)
R52  value 510R  [0603R]  (hidden comment: 510R 1% 0.1W)
R53  value 510R  [0603R]  (hidden comment: 510R 1% 0.1W)
R54  value 510R  [0603R]  (hidden comment: 510R 1% 0.1W)
R55  value 510R  [0603R]  (hidden comment: 510R 1% 0.1W)
R56  value 510R  [0603R]  (hidden comment: 510R 1% 0.1W)
R57  value 1k  [0603R]  (hidden comment: 1k 1% 0.1W)
R58  value 1k  [0603R]  (hidden comment: 1k 1% 0.1W)
R59  value 1k  [0603R]  (hidden comment: 1k 1% 0.1W)
R60  value 1k  [0603R]  (hidden comment: 1k 1% 0.1W)
R61  value 1k  [0603R]  (hidden comment: 1k 1% 0.1W)
R62  value 10k  [0603R]  (hidden comment: 10k 1% 0.1W)
R63  value 10k  [0603R]  (hidden comment: 10k 1% 0.1W)
R64  value 10k  [0603R]  (hidden comment: 10k 1% 0.1W)
R65  value 10k  [0603R]  (hidden comment: 10k 1% 0.1W)
R66  value 10k  [0603R]  (hidden comment: 10k 1% 0.1W)
Rel1  AC-12D-C-S  [AC-12D-C-S]
Rel2  AC-12D-C-S  [AC-12D-C-S]
SW1  Tact switch 6x6mm 7mm height SMD  [TACT switch SMT 7mm height]  (value not drawn)
SW2  Tact switch 6x6mm 7mm height SMD  [TACT switch SMT 7mm height]  (value not drawn)
T4  T2N7002BK,LM(T  [SOT95P235X110-3N]
T5  T2N7002BK,LM(T  [SOT95P235X110-3N]
T6  T2N7002BK,LM(T  [SOT95P235X110-3N]
T7  T2N7002BK,LM(T  [SOT95P235X110-3N]
T8  T2N7002BK,LM(T  [SOT95P235X110-3N]
T9  T2N7002BK,LM(T  [SOT95P235X110-3N]
T10  T2N7002BK,LM(T  [SOT95P235X110-3N]

### Ports
LED1 (in), LED2 (in), LED3 (in), LED4 (in), LED5 (in), REL1_COM (in), REL1_CTRL (in), REL1_NC (out), REL1_NO (out), REL2_COM (in), REL2_CTRL (in), REL2_NC (out), REL2_NO (out), SWITCH_1 (out), SWITCH_2 (out)

### Nets
3V3: C79.2 C80.2 R52.1 R53.1 R54.1 R55.1 R56.1
12V: D12.1 D13.1 Rel1.2(COIL1) Rel2.2(COIL1)
GND: R48.2 R49.2 R50.2 R51.2 R62.2 R63.2 R64.2 R65.2 R66.2 SW1.2 SW2.2 T4.2(E) T5.2(E) T6.2(E) T7.2(E) T8.2(E) T9.2(E) T10.2(E)
NetC79_1: C79.1 R48.1 SW1.1 ; port SWITCH_1
NetC80_1: C80.1 R49.1 SW2.1 ; port SWITCH_2
NetD12_2: D12.2 Rel1.3(COIL2) T4.3(C)
NetD13_2: D13.2 Rel2.3(COIL2) T5.3(C)
NetD14_1: D14.1 R52.2
NetD14_2: D14.2 T6.3(C)
NetD15_1: D15.1 R53.2
NetD15_2: D15.2 T7.3(C)
NetD16_1: D16.1 R54.2
NetD16_2: D16.2 T8.3(C)
NetD17_1: D17.1 R55.2
NetD17_2: D17.2 T9.3(C)
NetD18_1: D18.1 R56.2
NetD18_2: D18.2 T10.3(C)
NetR46_1: R46.1 R50.1 T4.1(B)
NetR46_2: R46.2 ; port REL2_CTRL
NetR47_1: R47.1 R51.1 T5.1(B)
NetR47_2: R47.2 ; port REL1_CTRL
NetR57_1: R57.1 R62.1 T6.1(B)
NetR57_2: R57.2 ; port LED1
NetR58_1: R58.1 R63.1 T7.1(B)
NetR58_2: R58.2 ; port LED2
NetR59_1: R59.1 R64.1 T8.1(B)
NetR59_2: R59.2 ; port LED3
NetR60_1: R60.1 R65.1 T9.1(B)
NetR60_2: R60.2 ; port LED4
NetR61_1: R61.1 R66.1 T10.1(B)
NetR61_2: R61.2 ; port LED5
NetRel1_1: Rel1.1(COM) ; port REL2_COM
NetRel1_4: Rel1.4(NC) ; port REL2_NC
NetRel1_5: Rel1.5(NO) ; port REL2_NO
NetRel2_1: Rel2.1(COM) ; port REL1_COM
NetRel2_4: Rel2.4(NC) ; port REL1_NC
NetRel2_5: Rel2.5(NO) ; port REL1_NO

### Notes on the sheet
- This document and the information it
- contains, including the principles of
- design are the proprietary confidential
- property of MC Electronics.
- Maciej Czerwiński Electronics
- NIP: PL1251711124
- Konopnickiej 16A
- 05-250 Radzymin
- biuro@mcelectronics.biz
- This information is submitted to you
- with the agreement that it is not to be
- disclosed to third parties without prior
- written consent from MC Electronics.
- Acceptance of this document constitutes
- Title:
- greement to these restrictions.
- Date:
- Project ID
- Sheet:
- of
- Module ID -
- Revision
- -
- Size A3

### Library data of the parts
C79 C80 = GEN_100nF_50V_X7R_10%_0603: as C77 on sheet RFID; Mount type: SMT
D12 D13 = 1N4448WS: 1N4448WS Switching diode 75V, 0,25A; Generic: No; MC_ID: D00139; Mount type: SMT; Specific PN: 1N4448WS
D14 = LED 0603 yellow: Generic yellow LED 0603; Generic: Yes; MC_ID: -; Specific PN: -; Mount type: SMT
D15 D16 = LED 0603 green: Generic green LED 0603; Generic: Yes; MC_ID: -; Specific PN: -; Mount type: SMT
D17 D18 = LED 0603 red: Generic red LED 0603; Generic: Yes; Mount type: SMT; MC_ID: -; Specific PN: -
R46 R47 R57-R61 = GEN_1k_1%_0.1W_0603: as R42 on sheet RFID; Mount type: SMT
R48-R51 R62-R66 = GEN_10k_1%_0.1W_0603: as R44 on sheet RFID; Mount type: SMT
R52-R56 = GEN_510R_1%_0.1W_0603: Generic resistor 510R 0603; Generic: Yes; MC_ID: R00005; Mount type: SMT
Rel1 Rel2 = AC-12D-C-S: Przekaźnik: elektromagnetyczny; SPST-NO; Ucewki: 12VDC; 15A/14VDC; MC_ID: REL00016; Generic: No; Mount type: THT; Specific PN: AC-12D-C-S
SW1 SW2 = WE_430152070826: MC_ID: SW00084; Generic: Yes; Mount type: SMT; Specific PN: WE_430152070826
T4-T10 = T2N7002BK,LM(T: as T2 on sheet RFID; Mount type: SMT; Specific PN: T2N7002BK,LM(T

## Sheet ANALOG_MEASUREMENT_CIRCUIT.SchDoc: Wpisz tekst
size A3; SheetNumber: 3; SheetTotal: 9
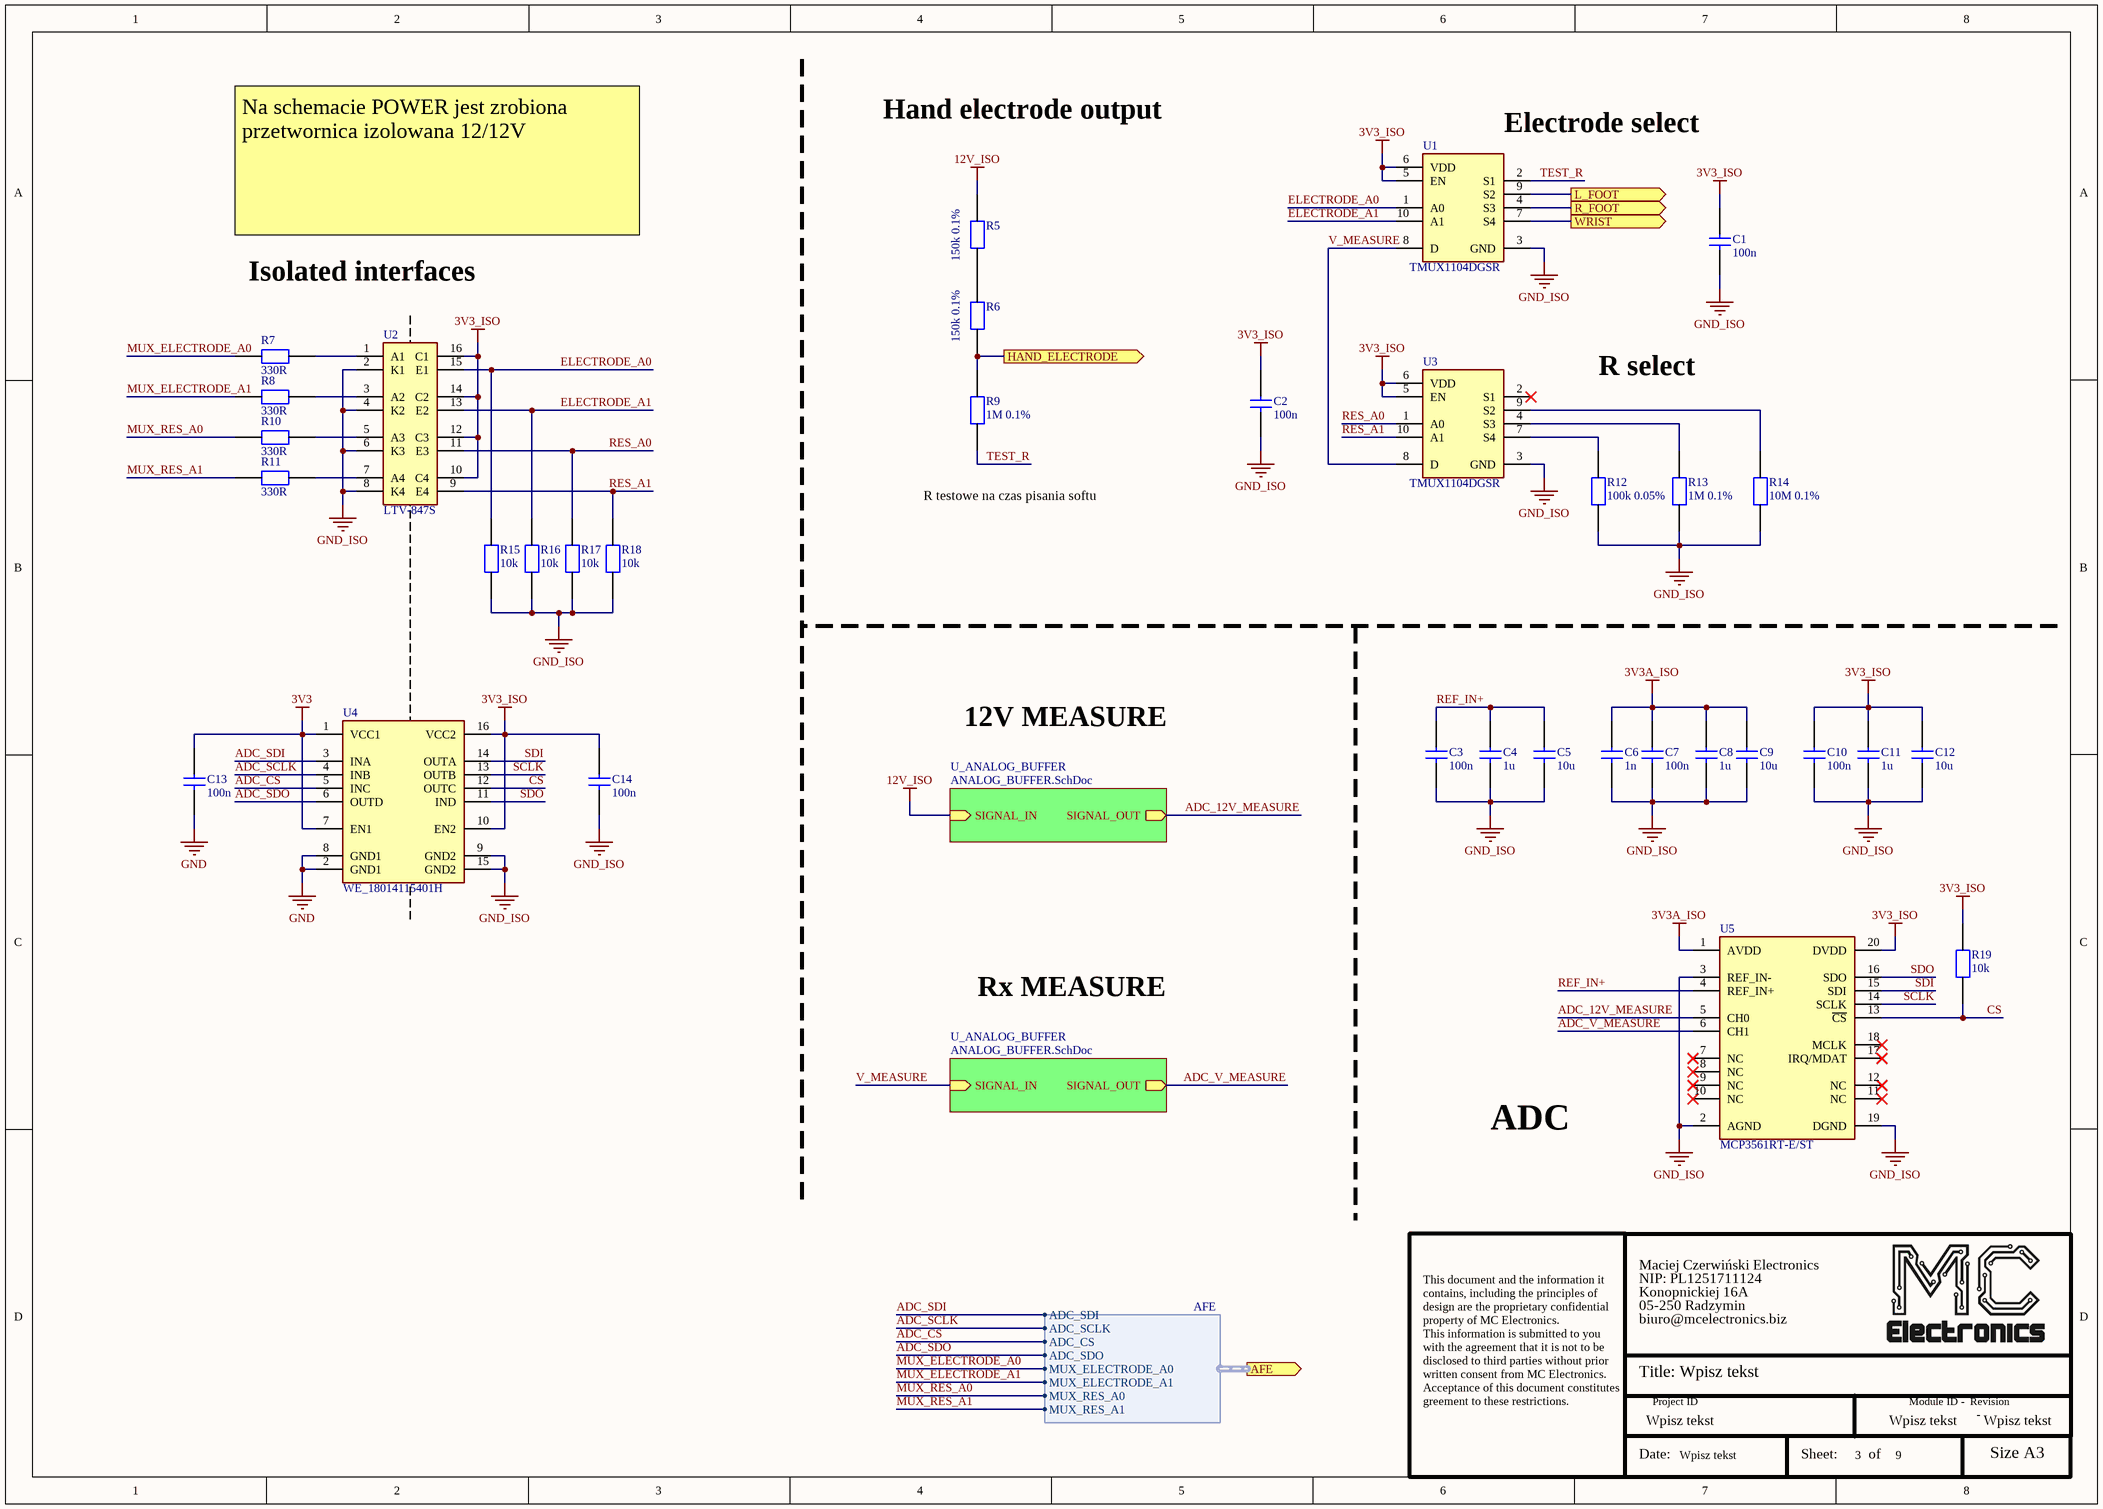
[diagram p6: ANALOG_MEASUREMENT_CIRCUIT.SchDoc]

### Parts
C1  value 100n  [0603C]  (hidden comment: 100nF 50V X7R 10%)
C2  value 100n  [0603C]  (hidden comment: 100nF 50V X7R 10%)
C3  value 100n  [0603C]  (hidden comment: 100nF 50V X7R 10%)
C4  value 1u  [0603C]  (hidden comment: 1uF 16V X5R 10%)
C5  value 10u  [0603C]  (hidden comment: 10uF 25V X5R 10%)
C6  value 1n  [0603C]  (hidden comment: 1nF 50V X7R 10%)
C7  value 100n  [0603C]  (hidden comment: 100nF 50V X7R 10%)
C8  value 1u  [0603C]  (hidden comment: 1uF 16V X5R 10%)
C9  value 10u  [0603C]  (hidden comment: 10uF 25V X5R 10%)
C10  value 100n  [0603C]  (hidden comment: 100nF 50V X7R 10%)
C11  value 1u  [0603C]  (hidden comment: 1uF 16V X5R 10%)
C12  value 10u  [0603C]  (hidden comment: 10uF 25V X5R 10%)
C13  value 100n  [0603C]  (hidden comment: 100nF 50V X7R 10%)
C14  value 100n  [0603C]  (hidden comment: 100nF 50V X7R 10%)
R5  value 150k 0.1%  [0603R]  (hidden comment: 150k 0.1% 0.1W)
R6  value 150k 0.1%  [0603R]  (hidden comment: 150k 0.1% 0.1W)
R7  value 330R  [0603R]  (hidden comment: 330R 1% 0.1W)
R8  value 330R  [0603R]  (hidden comment: 330R 1% 0.1W)
R9  value 1M 0.1%  [0603R]  (hidden comment: 1M 0.1% 0.1W)
R10  value 330R  [0603R]  (hidden comment: 330R 1% 0.1W)
R11  value 330R  [0603R]  (hidden comment: 330R 1% 0.1W)
R12  value 100k 0.05%  [0603R]  (hidden comment: 100k 0.05% 0.167W)
R13  value 1M 0.1%  [0603R]  (hidden comment: 1M 0.1% 0.1W)
R14  value 10M 0.1%  [1206R]  (hidden comment: 10M 0.1% 0.5W)
R15  value 10k  [0603R]  (hidden comment: 10k 1% 0.1W)
R16  value 10k  [0603R]  (hidden comment: 10k 1% 0.1W)
R17  value 10k  [0603R]  (hidden comment: 10k 1% 0.1W)
R18  value 10k  [0603R]  (hidden comment: 10k 1% 0.1W)
R19  value 10k  [0603R]  (hidden comment: 10k 1% 0.1W)
U1  TMUX1104DGSR  [SOP50P490X110-10N]
U2  LTV-847S  [SOP254P600-16N]
U3  TMUX1104DGSR  [SOP50P490X110-10N]
U4  WE_18014115401H  [WPME-CDIS_SOIC-16WB_18014x15401x]
U5  MCP3561RT-E/ST  [TSOP65P640X120-20N]

### Sub-sheets
U_ANALOG_BUFFER = ANALOG_BUFFER.SchDoc: SIGNAL_IN (in), SIGNAL_OUT (out)
U_ANALOG_BUFFER = ANALOG_BUFFER.SchDoc: SIGNAL_IN (in), SIGNAL_OUT (out)

### Ports
AFE (out, harness AFE), HAND_ELECTRODE (out), L_FOOT (out), R_FOOT (out), WRIST (out)

### Harnesses
AFE: ADC_SDI, ADC_SCLK, ADC_CS, ADC_SDO, MUX_ELECTRODE_A1, MUX_RES_A0, MUX_RES_A1, MUX_ELECTRODE_A0

### Nets
3V3: C13.2 U4.1(VCC1) U4.7(EN1)
3V3_ISO: C1.2 C2.2 C10.2 C11.2 C12.2 C14.2 R19.1 U1.5(EN) U1.6(VDD) U2.10(C4) U2.12(C3) U2.14(C2) U2.16(C1) U3.5(EN) U3.6(VDD) U4.10(EN2) U4.16(VCC2) U5.20(DVDD)
3V3A_ISO: C6.2 C7.2 C8.2 C9.2 U5.1(AVDD)
12V_ISO: R5.1 ; sheet U_ANALOG_BUFFER/SIGNAL_IN
GND: C13.1 U4.2(GND1) U4.8(GND1)
GND_ISO: C1.1 C2.1 C3.1 C4.1 C5.1 C6.1 C7.1 C8.1 C9.1 C10.1 C11.1 C12.1 C14.1 R12.2 R13.2 R14.2 R15.2 R16.2 R17.2 R18.2 U1.3(GND) U2.2(K1) U2.4(K2) U2.6(K3) U2.8(K4) U3.3(GND) U4.9(GND2) U4.15(GND2) U5.2(AGND) U5.3(REF_IN-) U5.19(DGND)
ADC_12V_MEASURE: U5.5(CH0) ; sheet U_ANALOG_BUFFER/SIGNAL_OUT
ADC_CS: U4.5(INC) ; port AFE.ADC_CS
ADC_SCLK: U4.4(INB) ; port AFE.ADC_SCLK
ADC_SDI: U4.3(INA) ; port AFE.ADC_SDI
ADC_SDO: U4.6(OUTD) ; port AFE.ADC_SDO
ADC_V_MEASURE: U5.6(CH1) ; sheet U_ANALOG_BUFFER/SIGNAL_OUT
CS: R19.2 U4.12(OUTC) U5.13(~{CS})
ELECTRODE_A0: R15.1 U1.1(A0) U2.15(E1)
ELECTRODE_A1: R16.1 U1.10(A1) U2.13(E2)
MUX_ELECTRODE_A0: R7.2 ; port AFE.MUX_ELECTRODE_A0
MUX_ELECTRODE_A1: R8.2 ; port AFE.MUX_ELECTRODE_A1
MUX_RES_A0: R10.2 ; port AFE.MUX_RES_A0
MUX_RES_A1: R11.2 ; port AFE.MUX_RES_A1
REF_IN+: C3.2 C4.2 C5.2 U5.4(REF_IN+)
RES_A0: R17.1 U2.11(E3) U3.1(A0)
RES_A1: R18.1 U2.9(E4) U3.10(A1)
SCLK: U4.13(OUTB) U5.14(SCLK)
SDI: U4.14(OUTA) U5.15(SDI)
SDO: U4.11(IND) U5.16(SDO)
TEST_R: R9.2 U1.2(S1)
V_MEASURE: U1.8(D) U3.8(D) ; sheet U_ANALOG_BUFFER/SIGNAL_IN
NetR5_2: R5.2 R6.1
NetR6_2: R6.2 R9.1 ; port HAND_ELECTRODE
NetR7_1: R7.1 U2.1(A1)
NetR8_1: R8.1 U2.3(A2)
NetR10_1: R10.1 U2.5(A3)
NetR11_1: R11.1 U2.7(A4)
NetR12_1: R12.1 U3.7(S4)
NetR13_1: R13.1 U3.4(S3)
NetR14_1: R14.1 U3.9(S2)
NetU1_4: U1.4(S3) ; port R_FOOT
NetU1_7: U1.7(S4) ; port WRIST
NetU1_9: U1.9(S2) ; port L_FOOT

Not connected (* = marked no-connect by the designer): U3 2(S1)*; U5 7(NC)* 8(NC)* 9(NC)* 10(NC)* 11(NC)* 12(NC)* 17(IRQ/MDAT)* 18(MCLK)*

### Notes on the sheet
- Hand electrode output
- (near U1) Electrode select
- Na schemacie POWER jest zrobiona przetwornica izolowana 12/12V
- Isolated interfaces
- R select
- R testowe na czas pisania softu
- 12V MEASURE
- Rx MEASURE
- ADC
- This document and the information it
- contains, including the principles of
- design are the proprietary confidential
- property of MC Electronics.
- Maciej Czerwiński Electronics
- NIP: PL1251711124
- Konopnickiej 16A
- 05-250 Radzymin
- biuro@mcelectronics.biz
- This information is submitted to you
- with the agreement that it is not to be
- disclosed to third parties without prior
- written consent from MC Electronics.
- Acceptance of this document constitutes
- Title:
- greement to these restrictions.
- Date:
- Project ID
- Sheet:
- of
- Module ID -
- Revision
- -
- Size A3

### Library data of the parts
C1-C3 C7 C10 C13 C14 = GEN_100nF_50V_X7R_10%_0603: as C77 on sheet RFID; Mount type: SMT
C4 C8 C11 = GEN_1uF_16V_X5R_10%_0603: as C68 on sheet ETHERNET; Mount type: SMT
C5 C9 C12 = GEN_10uF_25V_X5R_10%_0603: as C72 on sheet ETHERNET; Mount type: SMT
C6 = GEN_1nF_50V_X7R_10%_0603: as C76 on sheet ETHERNET; Mount type: SMT
R5 R6 = SPEC_150k_0.1%_0.1W_0603: Rezystor: thin film; 150kΩ; SMD; 0603; 100mW; ±0,1%; ERA3AEB 25ppm/C; Generic: Yes; MC_ID: xx; Specific PN: ERA3AEB154V; Mount type: SMT
R7 R8 R10 R11 = GEN_330R_1%_0.1W_0603: Generic resistor 330R 0603; Generic: Yes; MC_ID: R00067; Mount type: SMT
R9 R13 = SPEC_1M_0.1%_0.1W_0603: Rezystor: thin film; 1MΩ; precyzyjny; SMD; 0603; 0,1W; ±0,1%; AR; 75V 25ppm; Generic: Yes; MC_ID: xx; Specific PN: AR03BTCX1004; Mount type: SMT
R12 = SPEC_100k_0.05%_167mW_0603: Rezystor: thin film; 100kΩ; 0603; 167mW; ±0,05%; ARM-A; 10ppm/°C; Generic: Yes; MC_ID: xx; Specific PN: ARM03ATBM1003A; Mount type: SMT
R14 = SPEC_10M_0.1%_0.5W_1206: Rezystor: thin film; 10MΩ; precyzyjny; SMD; 1206; 0,5W; ±0,1%; 100V 25ppm; Generic: Yes; MC_ID: xx; Specific PN: MCA1206MD1005BP100; Mount type: SMT
R15-R19 = GEN_10k_1%_0.1W_0603: as R44 on sheet RFID; Mount type: SMT
U1 U3 = TMUX1104DGSR: TMUX1104DGSR Analog multiplexer 4:1; MC_ID: xx; Generic: No; Specific PN: TMUX1104DGSR; Mount type: SMT
U2 = LTV-847S: Transoptor; SMD; Ch: 4; OUT: tranzystorowe; Uizol: 5kV; Uce: 35V; Generic: No; MC_ID: xx; Mount type: SMT; Specific PN: LTV-847S
U4 = WE_18014115401H: 4 (3/1)channel digital isolator, 150Mbps; Generic: No; MC_ID: x; Specific PN: WE_18014115401H; Mount type: SMT
U5 = MCP3561RT-E/ST: Analog to Digital Converters - ADC 24-bit delta-sigma ADC w/Vref, Single channel, 3V, 2CH; MC_ID: xx; Generic: No; Specific PN: MCP3561RT-E/ST; Mount type: SMT

## Sheet ANALOG_BUFFER.SchDoc: Wpisz tekst
size A3; SheetNumber: 4; SheetTotal: 9
Used 2 times, as channels U_Main/U_ANALOG_MEASUREMENT_CIRCUIT/U_ANALOG_BUFFER, U_Main/U_ANALOG_MEASUREMENT_CIRCUIT/U_ANALOG_BUFFER. Parts and nets are listed once, with the designators drawn on the sheet.
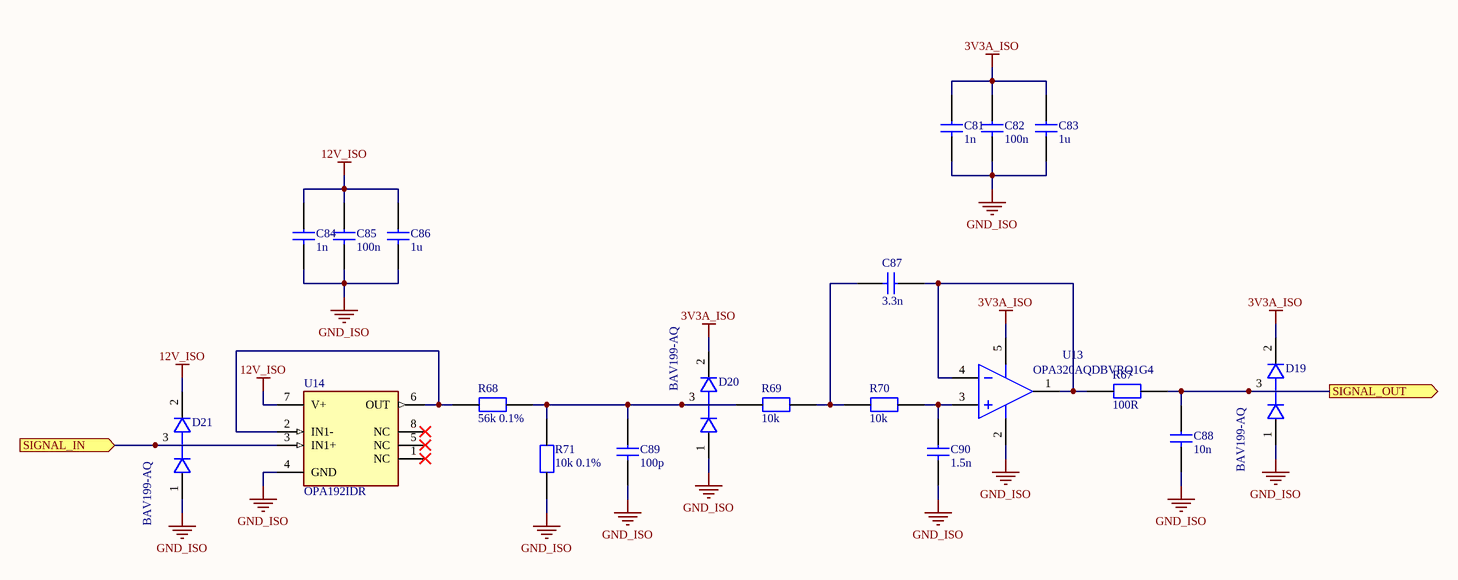
[diagram p7: ANALOG_BUFFER.SchDoc]

### Parts
C81  value 1n  [0603C]  (hidden comment: 1nF 50V X7R 10%)
C82  value 100n  [0603C]  (hidden comment: 100nF 50V X7R 10%)
C83  value 1u  [0603C]  (hidden comment: 1uF 16V X5R 10%)
C84  value 1n  [0603C]  (hidden comment: 1nF 50V X7R 10%)
C85  value 100n  [0603C]  (hidden comment: 100nF 50V X7R 10%)
C86  value 1u  [0603C]  (hidden comment: 1uF 16V X5R 10%)
C87  value 3.3n  [0603C]  (hidden comment: 3.3nF 50V X7R 10%)
C88  value 10n  [0603C]  (hidden comment: 10nF 50V X7R 10%)
C89  value 100p  [0603C]  (hidden comment: 100pF 50V C0G 5%)
C90  value 1.5n  [0603C]  (hidden comment: 1.5nF 50V X5R 5%)
D19  BAV199-AQ  [DIOD-SOT23-3_A_V]
D20  BAV199-AQ  [DIOD-SOT23-3_A_V]
D21  BAV199-AQ  [DIOD-SOT23-3_A_V]
R67  value 100R  [0603R]  (hidden comment: 100R 1% 0.1W)
R68  value 56k 0.1%  [0603R]  (hidden comment: 56k 0.1% 0.1W)
R69  value 10k  [0603R]  (hidden comment: 10k 1% 0.1W)
R70  value 10k  [0603R]  (hidden comment: 10k 1% 0.1W)
R71  value 10k 0.1%  [0603R]  (hidden comment: 10k 0.1% 0.1W)
U13  OPA320AQDBVRQ1G4  [SOT23]
U14  OPA192IDR  [SOIC127P600X175-8N]

### Ports
SIGNAL_IN (in), SIGNAL_OUT (out)

### Nets
3V3A_ISO: C81.2 C82.2 C83.2 D19.2 D20.2 U13.5(+V)
12V_ISO: C84.2 C85.2 C86.2 D21.2 U14.7(V+)
GND_ISO: C81.1 C82.1 C83.1 C84.1 C85.1 C86.1 C88.1 C89.1 C90.1 D19.1 D20.1 D21.1 R71.2 U13.2(-V) U14.4(GND)
SIGNAL_IN: D21.3 U14.3(IN1+) ; port SIGNAL_IN
SIGNAL_OUT: C88.2 D19.3 R67.1 ; port SIGNAL_OUT
NetC87_1: C87.1 R69.2 R70.1
NetC87_2: C87.2 R67.2 U13.1(OUT_A) U13.4(-IN_A)
NetC89_2: C89.2 D20.3 R68.1 R69.1 R71.1
NetC90_2: C90.2 R70.2 U13.3(+IN_A)
NetR68_2: R68.2 U14.2(IN1-) U14.6(OUT)

Not connected (* = marked no-connect by the designer): U14 1(NC)* 5(NC)* 8(NC)*

### Channels
U_Main/U_ANALOG_MEASUREMENT_CIRCUIT/U_ANALOG_BUFFER: designators end in A; ports SIGNAL_IN=NetD21A_3 SIGNAL_OUT=NetC88A_2
U_Main/U_ANALOG_MEASUREMENT_CIRCUIT/U_ANALOG_BUFFER: designators end in B; ports SIGNAL_IN=NetD21A_3 SIGNAL_OUT=NetC88A_2

### Notes on the sheet
- This document and the information it
- contains, including the principles of
- design are the proprietary confidential
- property of MC Electronics.
- Maciej Czerwiński Electronics
- NIP: PL1251711124
- Konopnickiej 16A
- 05-250 Radzymin
- biuro@mcelectronics.biz
- This information is submitted to you
- with the agreement that it is not to be
- disclosed to third parties without prior
- written consent from MC Electronics.
- Acceptance of this document constitutes
- Title:
- greement to these restrictions.
- Date:
- Project ID
- Sheet:
- of
- Module ID -
- Revision
- -
- Size A3

### Library data of the parts
C81 C84 = GEN_1nF_50V_X7R_10%_0603: as C76 on sheet ETHERNET; Mount type: SMT
C82 C85 = GEN_100nF_50V_X7R_10%_0603: as C77 on sheet RFID; Mount type: SMT
C83 C86 = GEN_1uF_16V_X5R_10%_0603: as C68 on sheet ETHERNET; Mount type: SMT
C87 = GEN_3.3nF_50V_X7R_10%_0603: Generic capacitor 3.3n 0603; MC_ID: C00112; Generic: Yes; Mount type: SMT
C88 = GEN_10nF_50V_X7R_10%_0603: as C36 on sheet POWER_SUPPLY; Mount type: SMT
C89 = GEN_100pF_50V_C0G_5%_0603: Generic capacitor 100p 0603; MC_ID: C00004; Generic: Yes; Mount type: SMT
C90 = GEN_1.5nF_50V_X5R_5%_0603: Generic capacitor 1.5nF 50V 0603; MC_ID: C00006; Generic: Yes; Mount type: SMT
D19-D21 = BAV199-AQ: Diode Standard Recovery Rectifier 85 Volt 0.16A 3-Pin SOT-23 Tape and Reel; Generic: No; MC_ID: xx; Specific PN: BAV199-AQ; Mount type: SMT
R67 = GEN_100R_1%_0.1W_0603: Generic resistor 100R 0603; MC_ID: R00090; Generic: Yes; Mount type: SMT
R68 = SPEC_56k_0.1%_0.1W_0603: Resistor 56k 0.1% 0603 25ppm/*C; MC_ID: xx; Specific PN: ERA3AEB563V; Generic: Yes; Mount type: SMT
R69 R70 = GEN_10k_1%_0.1W_0603: as R44 on sheet RFID; Mount type: SMT
R71 = SPEC_10k_0.1%_0.1W_0603: Resistor 10k 0.1% 0603 10ppm/*C; MC_ID: R00258; Specific PN: ERA3ARB103V; Generic: Yes; Mount type: SMT
U13 = OPA320AQDBVRQ1G4: Single low noise Op Amp, 1.8V-5.0V, 20MHz; Generic: No; MC_ID: IC00769; Mount type: SMT; Specific PN: OPA320AQDBVRQ1G4
U14 = OPA192IDR: Wzmacniacz operacyjny; 10MHz; Ch: 1; ±2,25÷18VDC,4,5÷36VDC; MC_ID: xx; Generic: No; Specific PN: OPA192IDR; Mount type: SMT

## Sheet MCU.SchDoc: Wpisz tekst
size A3; SheetNumber: 6; SheetTotal: 9
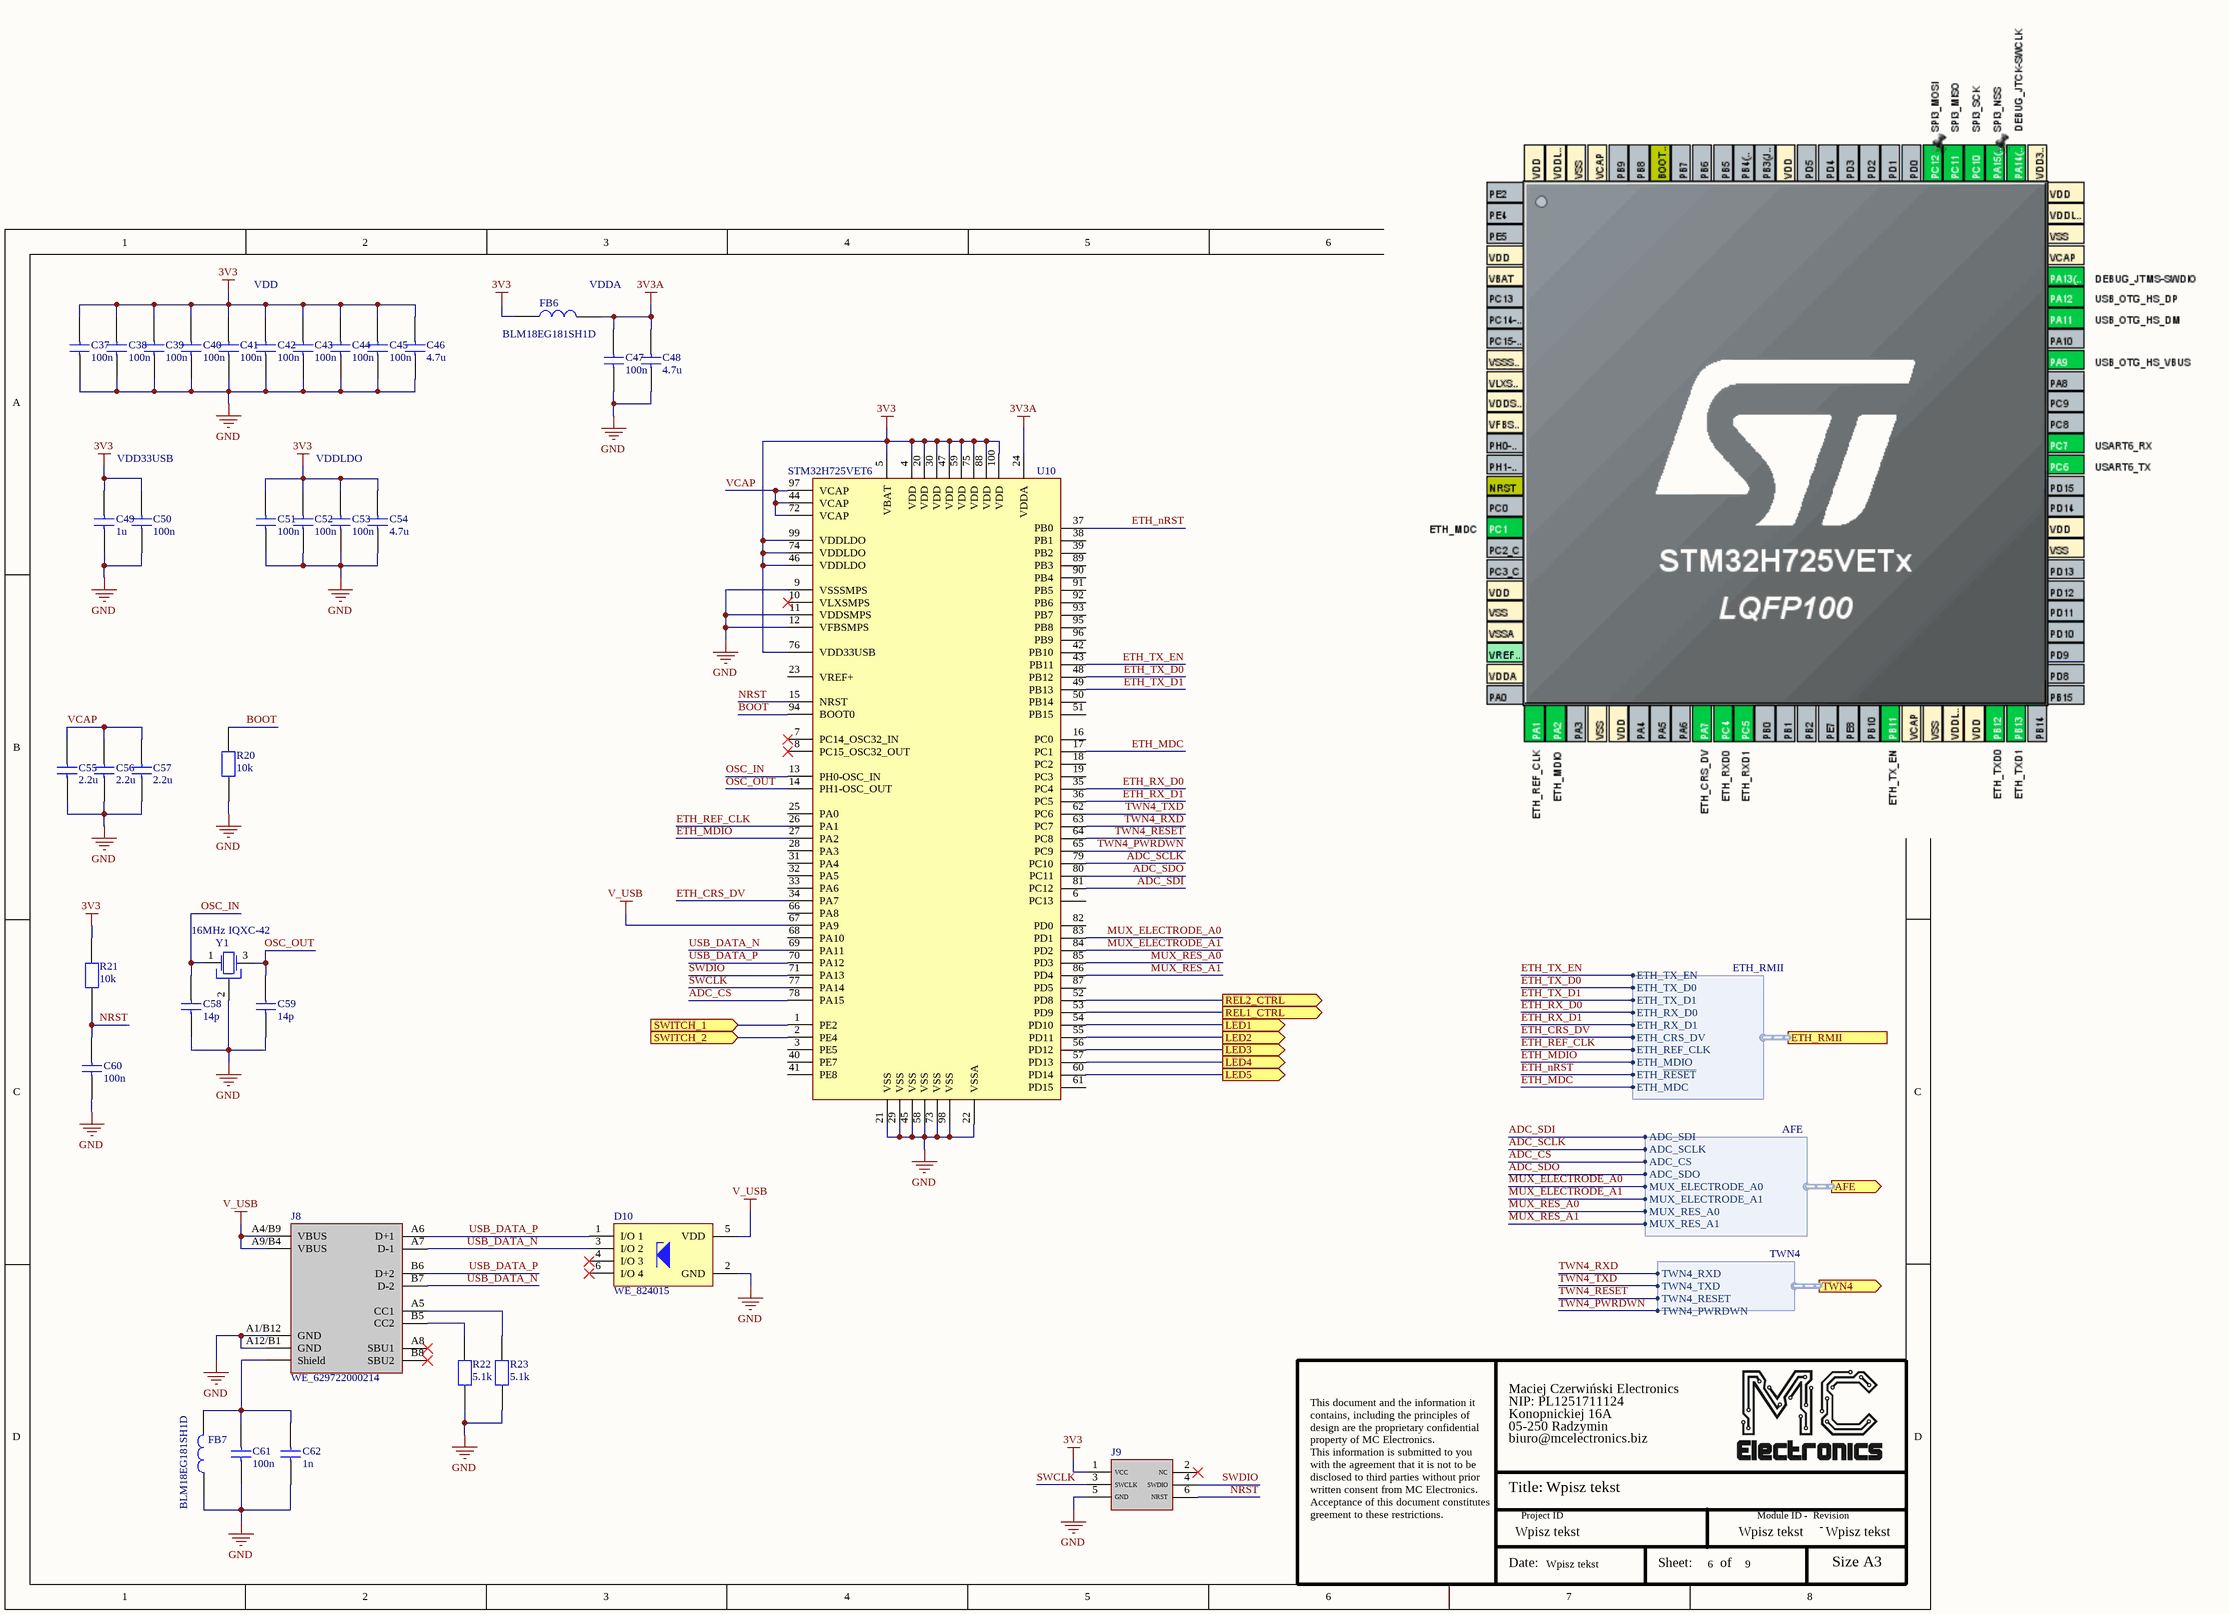
[diagram p8: MCU.SchDoc]

### Parts
C37  value 100n  [0603C]  (hidden comment: 100nF 50V X7R 10%)
C38  value 100n  [0603C]  (hidden comment: 100nF 50V X7R 10%)
C39  value 100n  [0603C]  (hidden comment: 100nF 50V X7R 10%)
C40  value 100n  [0603C]  (hidden comment: 100nF 50V X7R 10%)
C41  value 100n  [0603C]  (hidden comment: 100nF 50V X7R 10%)
C42  value 100n  [0603C]  (hidden comment: 100nF 50V X7R 10%)
C43  value 100n  [0603C]  (hidden comment: 100nF 50V X7R 10%)
C44  value 100n  [0603C]  (hidden comment: 100nF 50V X7R 10%)
C45  value 100n  [0603C]  (hidden comment: 100nF 50V X7R 10%)
C46  value 4.7u  [0603C]  (hidden comment: 4.7uF 16V X5R 10%)
C47  value 100n  [0603C]  (hidden comment: 100nF 50V X7R 10%)
C48  value 4.7u  [0603C]  (hidden comment: 4.7uF 16V X5R 10%)
C49  value 1u  [0603C]  (hidden comment: 1uF 16V X5R 10%)
C50  value 100n  [0603C]  (hidden comment: 100nF 50V X7R 10%)
C51  value 100n  [0603C]  (hidden comment: 100nF 50V X7R 10%)
C52  value 100n  [0603C]  (hidden comment: 100nF 50V X7R 10%)
C53  value 100n  [0603C]  (hidden comment: 100nF 50V X7R 10%)
C54  value 4.7u  [0603C]  (hidden comment: 4.7uF 16V X5R 10%)
C55  value 2.2u  [0603C]  (hidden comment: 2.2uF 16V X5R 10%)
C56  value 2.2u  [0603C]  (hidden comment: 2.2uF 16V X5R 10%)
C57  value 2.2u  [0603C]  (hidden comment: 2.2uF 16V X5R 10%)
C58  value 14p  [0402C]  (hidden comment: 14pF 50V C0G 2%)
C59  value 14p  [0402C]  (hidden comment: 14pF 50V C0G 2%)
C60  value 100n  [0603C]  (hidden comment: 100nF 50V X7R 10%)
C61  value 100n  [0603C]  (hidden comment: 100nF 50V X7R 10%)
C62  value 1n  [0603C]  (hidden comment: 1nF 50V X7R 10%)
D10  WE_824015  [SOT95P280X110-6N]
FB6  BLM18EG181SH1D  [0603FB]
FB7  BLM18EG181SH1D  [0603FB]
J8  WE_629722000214  [Wurth 629722000214]
J9  STM programming connector large  [STM programming connector 2.54mm]  (value not drawn)
R20  value 10k  [0603R]  (hidden comment: 10k 1% 0.1W)
R21  value 10k  [0603R]  (hidden comment: 10k 1% 0.1W)
R22  value 5.1k  [0603R]  (hidden comment: 5.1k 1% 0.1W)
R23  value 5.1k  [0603R]  (hidden comment: 5.1k 1% 0.1W)
U10  STM32H725VET6  [TSQFP-LQFP50P1600X1600X160-100N]
Y1  16MHz IQXC-42  [Quartz crystal 4pin 2x1.6mm]

### Ports
AFE (out, harness AFE), ETH_RMII (harness ETH_RMII), LED1 (out), LED2 (out), LED3 (out), LED4 (out), LED5 (out), REL1_CTRL (out), REL2_CTRL (out), SWITCH_1 (in), SWITCH_2 (in), TWN4 (out, harness TWN4)

### Harnesses
ETH_RMII: ETH_MDIO, ETH_~{RESET}, ETH_CRS_DV, ETH_RX_D1, ETH_RX_D0, ETH_TX_D1, ETH_TX_D0, ETH_TX_EN, ETH_REF_CLK, ETH_MDC
TWN4: TWN4_RXD, TWN4_TXD, TWN4_RESET, TWN4_PWRDWN
AFE: ADC_SDI, ADC_SCLK, ADC_CS, ADC_SDO, MUX_ELECTRODE_A1, MUX_RES_A0, MUX_RES_A1, MUX_ELECTRODE_A0

### Nets
3V3: C37.2 C38.2 C39.2 C40.2 C41.2 C42.2 C43.2 C44.2 C45.2 C46.2 C49.2 C50.2 C51.2 C52.2 C53.2 C54.2 FB6.1 J9.1(VCC) R21.1 U10.4(VDD) U10.5(VBAT) U10.20(VDD) U10.30(VDD) U10.46(VDDLDO) U10.47(VDD) U10.59(VDD) U10.74(VDDLDO) U10.75(VDD) U10.76(VDD33USB) U10.88(VDD) U10.99(VDDLDO) U10.100(VDD)
3V3A: C47.2 C48.2 FB6.2 U10.24(VDDA)
GND: C37.1 C38.1 C39.1 C40.1 C41.1 C42.1 C43.1 C44.1 C45.1 C46.1 C47.1 C48.1 C49.1 C50.1 C51.1 C52.1 C53.1 C54.1 C55.1 C56.1 C57.1 C58.1 C59.1 C60.1 C61.1 C62.1 D10.2(GND) FB7.1 J8.A1/B12(GND) J8.A12/B1(GND) J9.5(GND) R20.2 R22.2 R23.2 U10.9(VSSSMPS) U10.11(VDDSMPS) U10.12(VFBSMPS) U10.21(VSS) U10.22(VSSA) U10.29(VSS) U10.45(VSS) U10.58(VSS) U10.73(VSS) U10.98(VSS) Y1.2(GND)
V_USB: D10.5(VDD) J8.A4/B9(VBUS) J8.A9/B4(VBUS) U10.67(PA9)
ADC_CS: U10.78(PA15) ; port AFE.ADC_CS
ADC_SCLK: U10.79(PC10) ; port AFE.ADC_SCLK
ADC_SDI: U10.81(PC12) ; port AFE.ADC_SDI
ADC_SDO: U10.80(PC11) ; port AFE.ADC_SDO
BOOT: R20.1 U10.94(BOOT0)
ETH_CRS_DV: U10.34(PA7) ; port ETH_RMII.ETH_CRS_DV
ETH_MDC: U10.17(PC1) ; port ETH_RMII.ETH_MDC
ETH_MDIO: U10.27(PA2) ; port ETH_RMII.ETH_MDIO
ETH_nRST: U10.37(PB0) ; port ETH_RMII.ETH_~{RESET}
ETH_REF_CLK: U10.26(PA1) ; port ETH_RMII.ETH_REF_CLK
ETH_RX_D0: U10.35(PC4) ; port ETH_RMII.ETH_RX_D0
ETH_RX_D1: U10.36(PC5) ; port ETH_RMII.ETH_RX_D1
ETH_TX_D0: U10.48(PB12) ; port ETH_RMII.ETH_TX_D0
ETH_TX_D1: U10.49(PB13) ; port ETH_RMII.ETH_TX_D1
ETH_TX_EN: U10.43(PB11) ; port ETH_RMII.ETH_TX_EN
MUX_ELECTRODE_A0: U10.83(PD1) ; port AFE.MUX_ELECTRODE_A0
MUX_ELECTRODE_A1: U10.84(PD2) ; port AFE.MUX_ELECTRODE_A1
MUX_RES_A0: U10.85(PD3) ; port AFE.MUX_RES_A0
MUX_RES_A1: U10.86(PD4) ; port AFE.MUX_RES_A1
NRST: C60.2 J9.6(NRST) R21.2 U10.15(NRST)
OSC_IN: C58.2 U10.13(PH0-OSC_IN) Y1.1(Crystal)
OSC_OUT: C59.2 U10.14(PH1-OSC_OUT) Y1.3(Crystal)
SWCLK: J9.3(SWCLK) U10.77(PA14)
SWDIO: J9.4(SWDIO) U10.71(PA13)
TWN4_PWRDWN: U10.65(PC9) ; port TWN4.TWN4_PWRDWN
TWN4_RESET: U10.64(PC8) ; port TWN4.TWN4_RESET
TWN4_RXD: U10.63(PC7) ; port TWN4.TWN4_RXD
TWN4_TXD: U10.62(PC6) ; port TWN4.TWN4_TXD
USB_DATA_N: D10.3(I/O_2) J8.A7(D-1) J8.B7(D-2) U10.69(PA11)
USB_DATA_P: D10.1(I/O_1) J8.A6(D+1) J8.B6(D+2) U10.70(PA12)
VCAP: C55.2 C56.2 C57.2 U10.44(VCAP) U10.72(VCAP) U10.97(VCAP)
NetC61_2: C61.2 C62.2 FB7.2 J8.Shell(Shield)
NetC79_1: U10.1(PE2) ; port SWITCH_1
NetC80_1: U10.2(PE4) ; port SWITCH_2
NetJ8_A5: J8.A5(CC1) R23.1
NetJ8_B5: J8.B5(CC2) R22.1
NetR46_2: U10.52(PD8) ; port REL2_CTRL
NetR47_2: U10.53(PD9) ; port REL1_CTRL
NetR57_2: U10.54(PD10) ; port LED1
NetR58_2: U10.55(PD11) ; port LED2
NetR59_2: U10.56(PD12) ; port LED3
NetR60_2: U10.57(PD13) ; port LED4
NetR61_2: U10.60(PD14) ; port LED5

Not connected (* = marked no-connect by the designer): D10 4(I/O_3)* 6(I/O_4)*; J8 A8(SBU1)* B8(SBU2)*; J9 2(NC)*; U10 3(PE5) 6(PC13) 7(PC14_OSC32_IN)* 8(PC15_OSC32_OUT)* 10(VLXSMPS)* 16(PC0) 18(PC2) 19(PC3) 23(VREF+) 25(PA0) 28(PA3) 31(PA4) 32(PA5) 33(PA6) 38(PB1) 39(PB2) 40(PE7) 41(PE8) 42(PB10) 50(PB14) 51(PB15) 61(PD15) 66(PA8) 68(PA10) 82(PD0) 87(PD5) 89(PB3) 90(PB4) 91(PB5) 92(PB6) 93(PB7) 95(PB8) 96(PB9)

### Notes on the sheet
- VDD
- (near FB6) VDDA
- VDD33USB
- VDDLDO
- This document and the information it
- contains, including the principles of
- design are the proprietary confidential
- property of MC Electronics.
- Maciej Czerwiński Electronics
- NIP: PL1251711124
- Konopnickiej 16A
- 05-250 Radzymin
- biuro@mcelectronics.biz
- This information is submitted to you
- with the agreement that it is not to be
- disclosed to third parties without prior
- written consent from MC Electronics.
- Acceptance of this document constitutes
- Title:
- greement to these restrictions.
- Date:
- Project ID
- Sheet:
- of
- Module ID -
- Revision
- -
- Size A3

### Library data of the parts
C37-C45 C47 C50-C53 C60 C61 = GEN_100nF_50V_X7R_10%_0603: as C77 on sheet RFID; Mount type: SMT
C46 C48 C54 = GEN_4.7uF_16V_X5R_10%_0603: as C78 on sheet RFID; Mount type: SMT
C49 = GEN_1uF_16V_X5R_10%_0603: as C68 on sheet ETHERNET; Mount type: SMT
C55-C57 = GEN_2.2uF_16V_X5R_10%_0603: Generic capacitor 2.2u 0603; MC_ID: C00065; Generic: Yes; Mount type: SMT
C58 C59 = GEN_14pF_50V_C0G_2%_0402: Generic capacitor 14p 0402; Generic: Yes; MC_ID: C00085; Mount type: SMT
C62 = GEN_1nF_50V_X7R_10%_0603: as C76 on sheet ETHERNET; Mount type: SMT
D10 = WE_824015: as D11 on sheet ETHERNET; Mount type: SMT; Specific PN: WE_824015
FB6 FB7 = BLM18EG181SH1D: as FB9 on sheet ETHERNET; Specific PN: BLM18EG181SH1D; Mount type: SMT
J8 = WE_629722000214: Wurth USB C 2.0 connector; Generic: No; MC_ID: CON000211; Specific PN: WE_629722000214; Mount type: SMT
J9 = STM programming connector large: STM MC programming connector large; Generic: No; MC_ID: CON00192/CON00239; Specific PN: 90130-1106; Mount type: THT
R20 R21 = GEN_10k_1%_0.1W_0603: as R44 on sheet RFID; Mount type: SMT
R22 R23 = GEN_5.1k_1%_0.1W_0603: Generic resistor 5.1k 0603; Generic: Yes; MC_ID: R00007; Mount type: SMT
U10 = STM32H725VET6: STM32H725VET6 microcontroller; MC_ID: xx; Generic: No; Mount type: SMT; Specific PN: STM32H725VET6
Y1 = 16MHz IQXC-42: Quarz oscilator 16MHz 2x1.6x0.5mm; MC_ID: XTA00010; Specific PN: WE_830108288709; Generic: No; Mount type: SMT